# EasyEDA Pro project 4轴机器狗主控板_ProDoc_Board1_2026-10-02.epro, schematic Schematic1

## Sheets
1 引脚分配: Assembly Variant: Basic; Board Name: Board1; Create Date: 2026-08-26; Page Name: P1; Project Name: P006_5轴桌面机器狗; Schematic Name: Schematic1; Update Date: 2026-08-26; Company: 嘉立创EDA; Page Size: A4; Version: V1.0
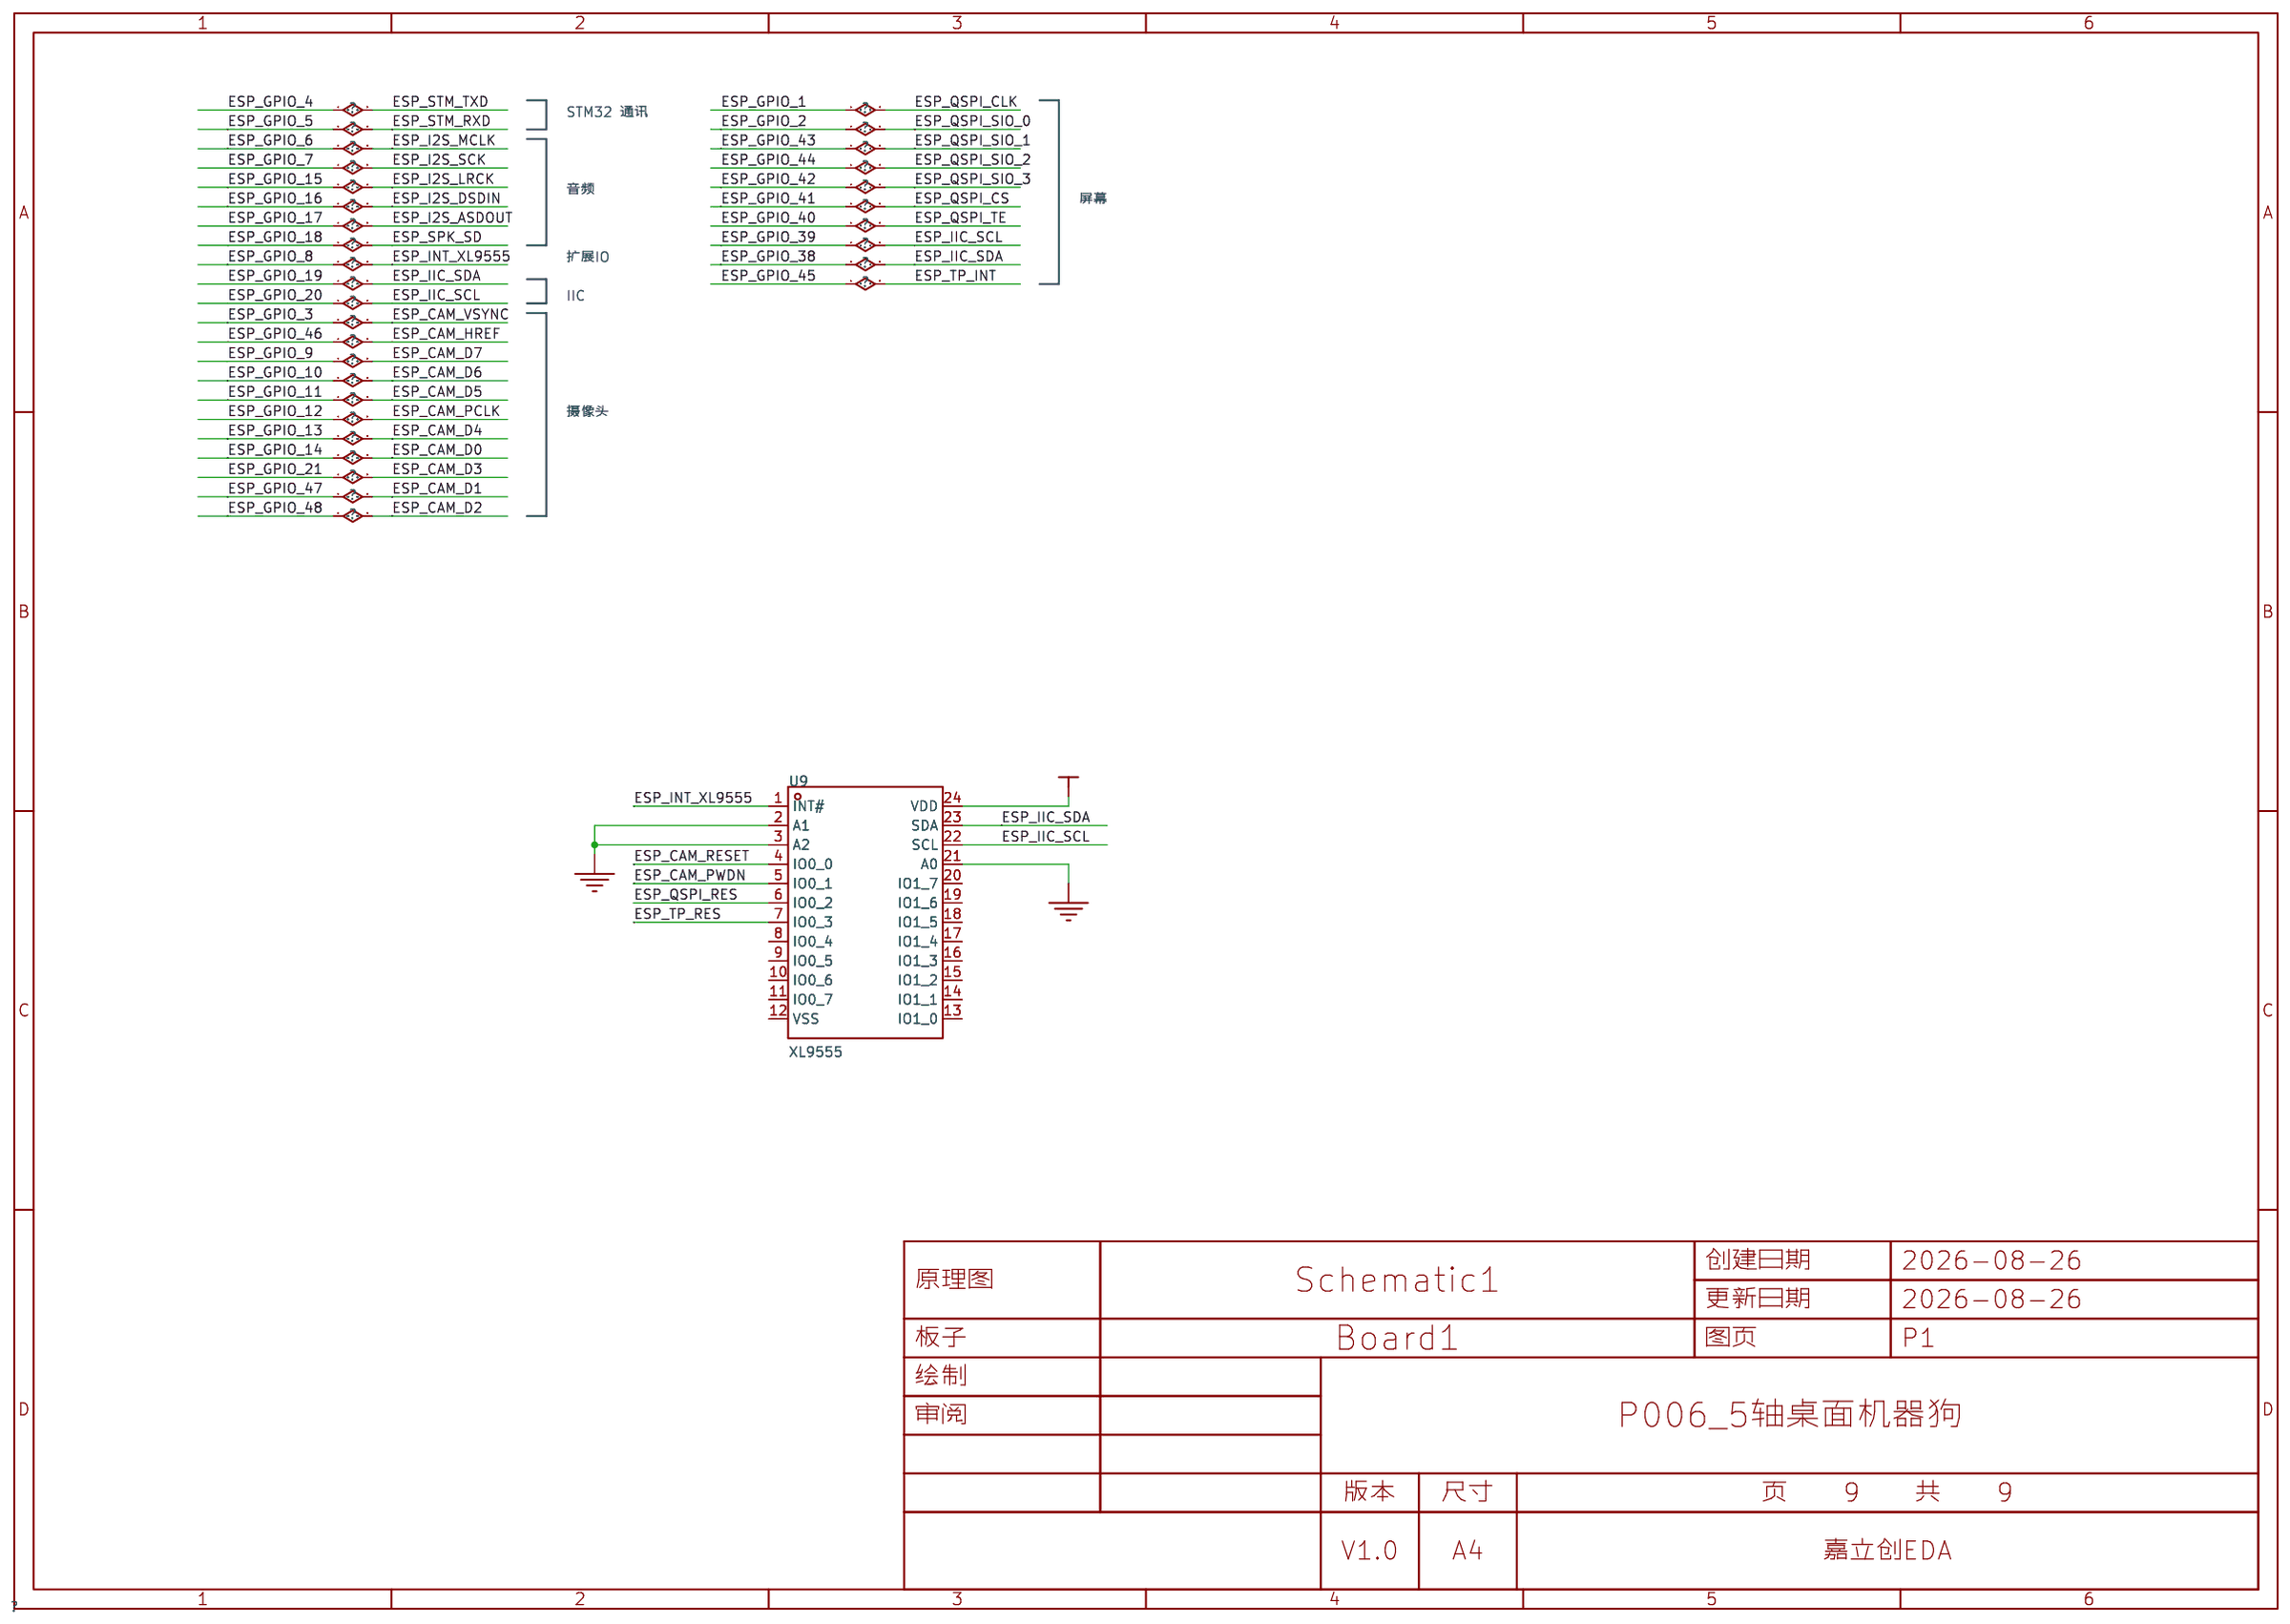
[diagram p0: 引脚分配]
2 电源电路: Create Date: 2026-08-21; Update Date: 2026-08-21
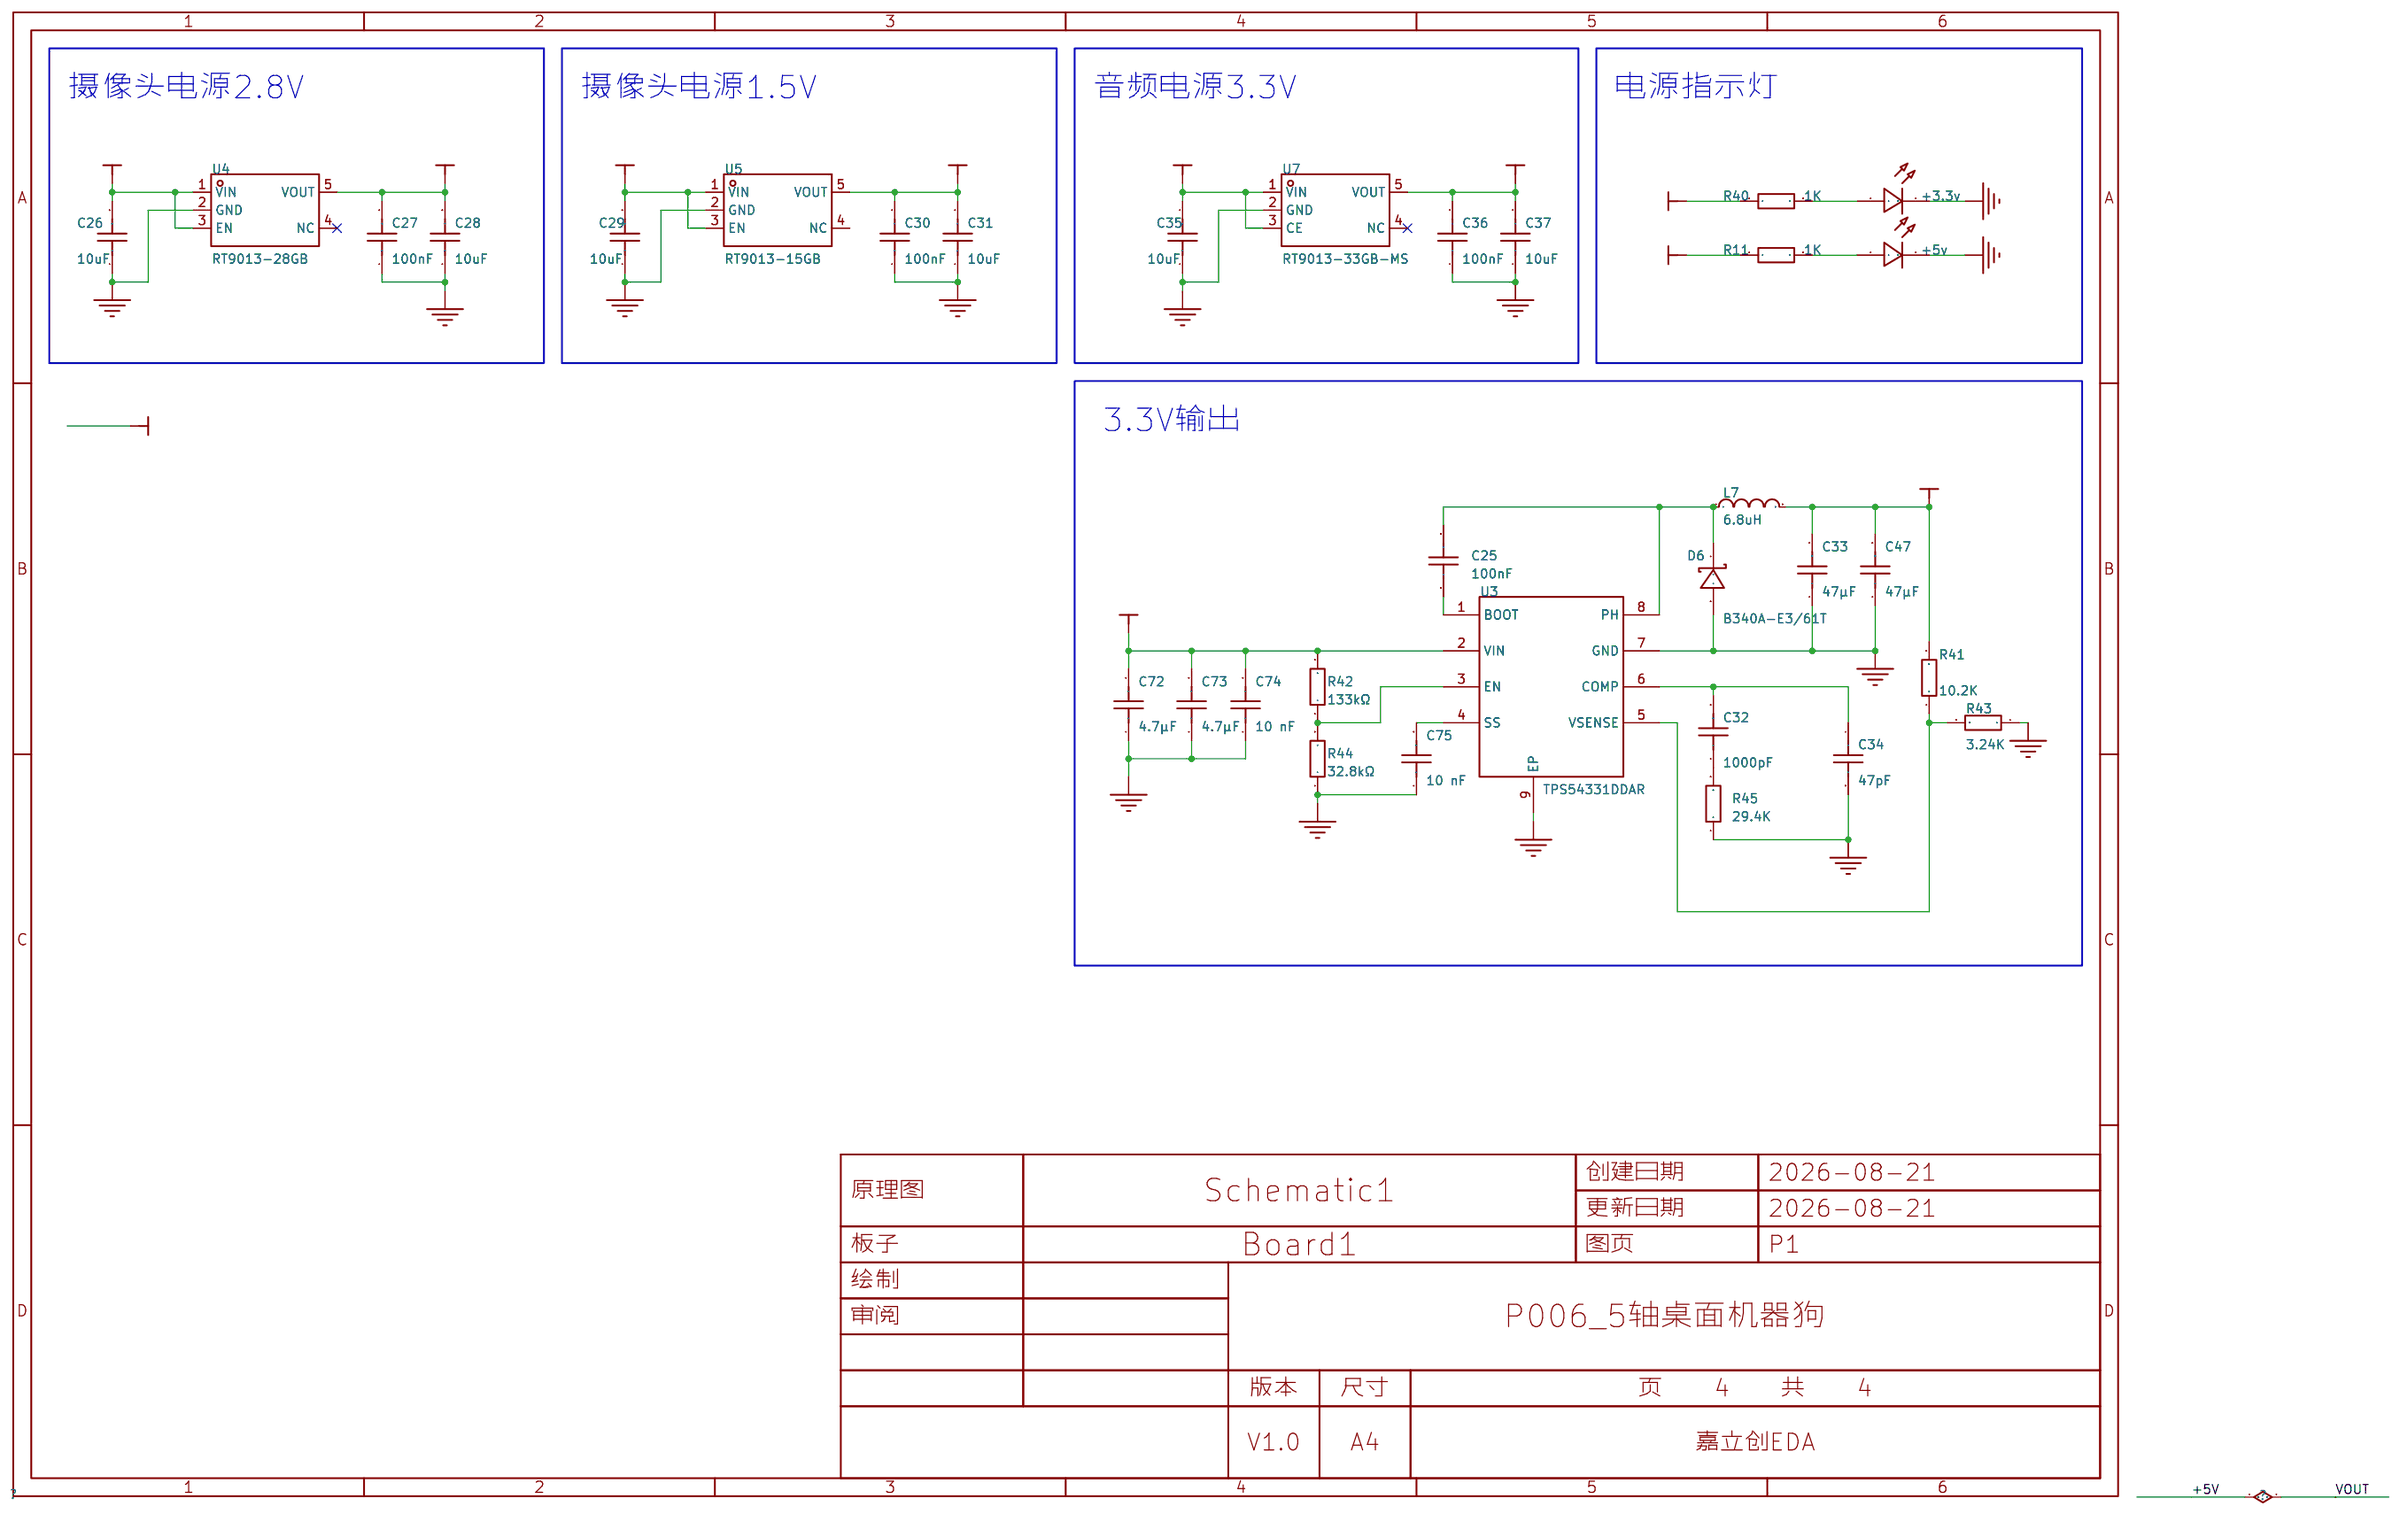
[diagram p1: 电源电路]
3 充电电路: Create Date: 2026-08-21; Update Date: 2026-08-21
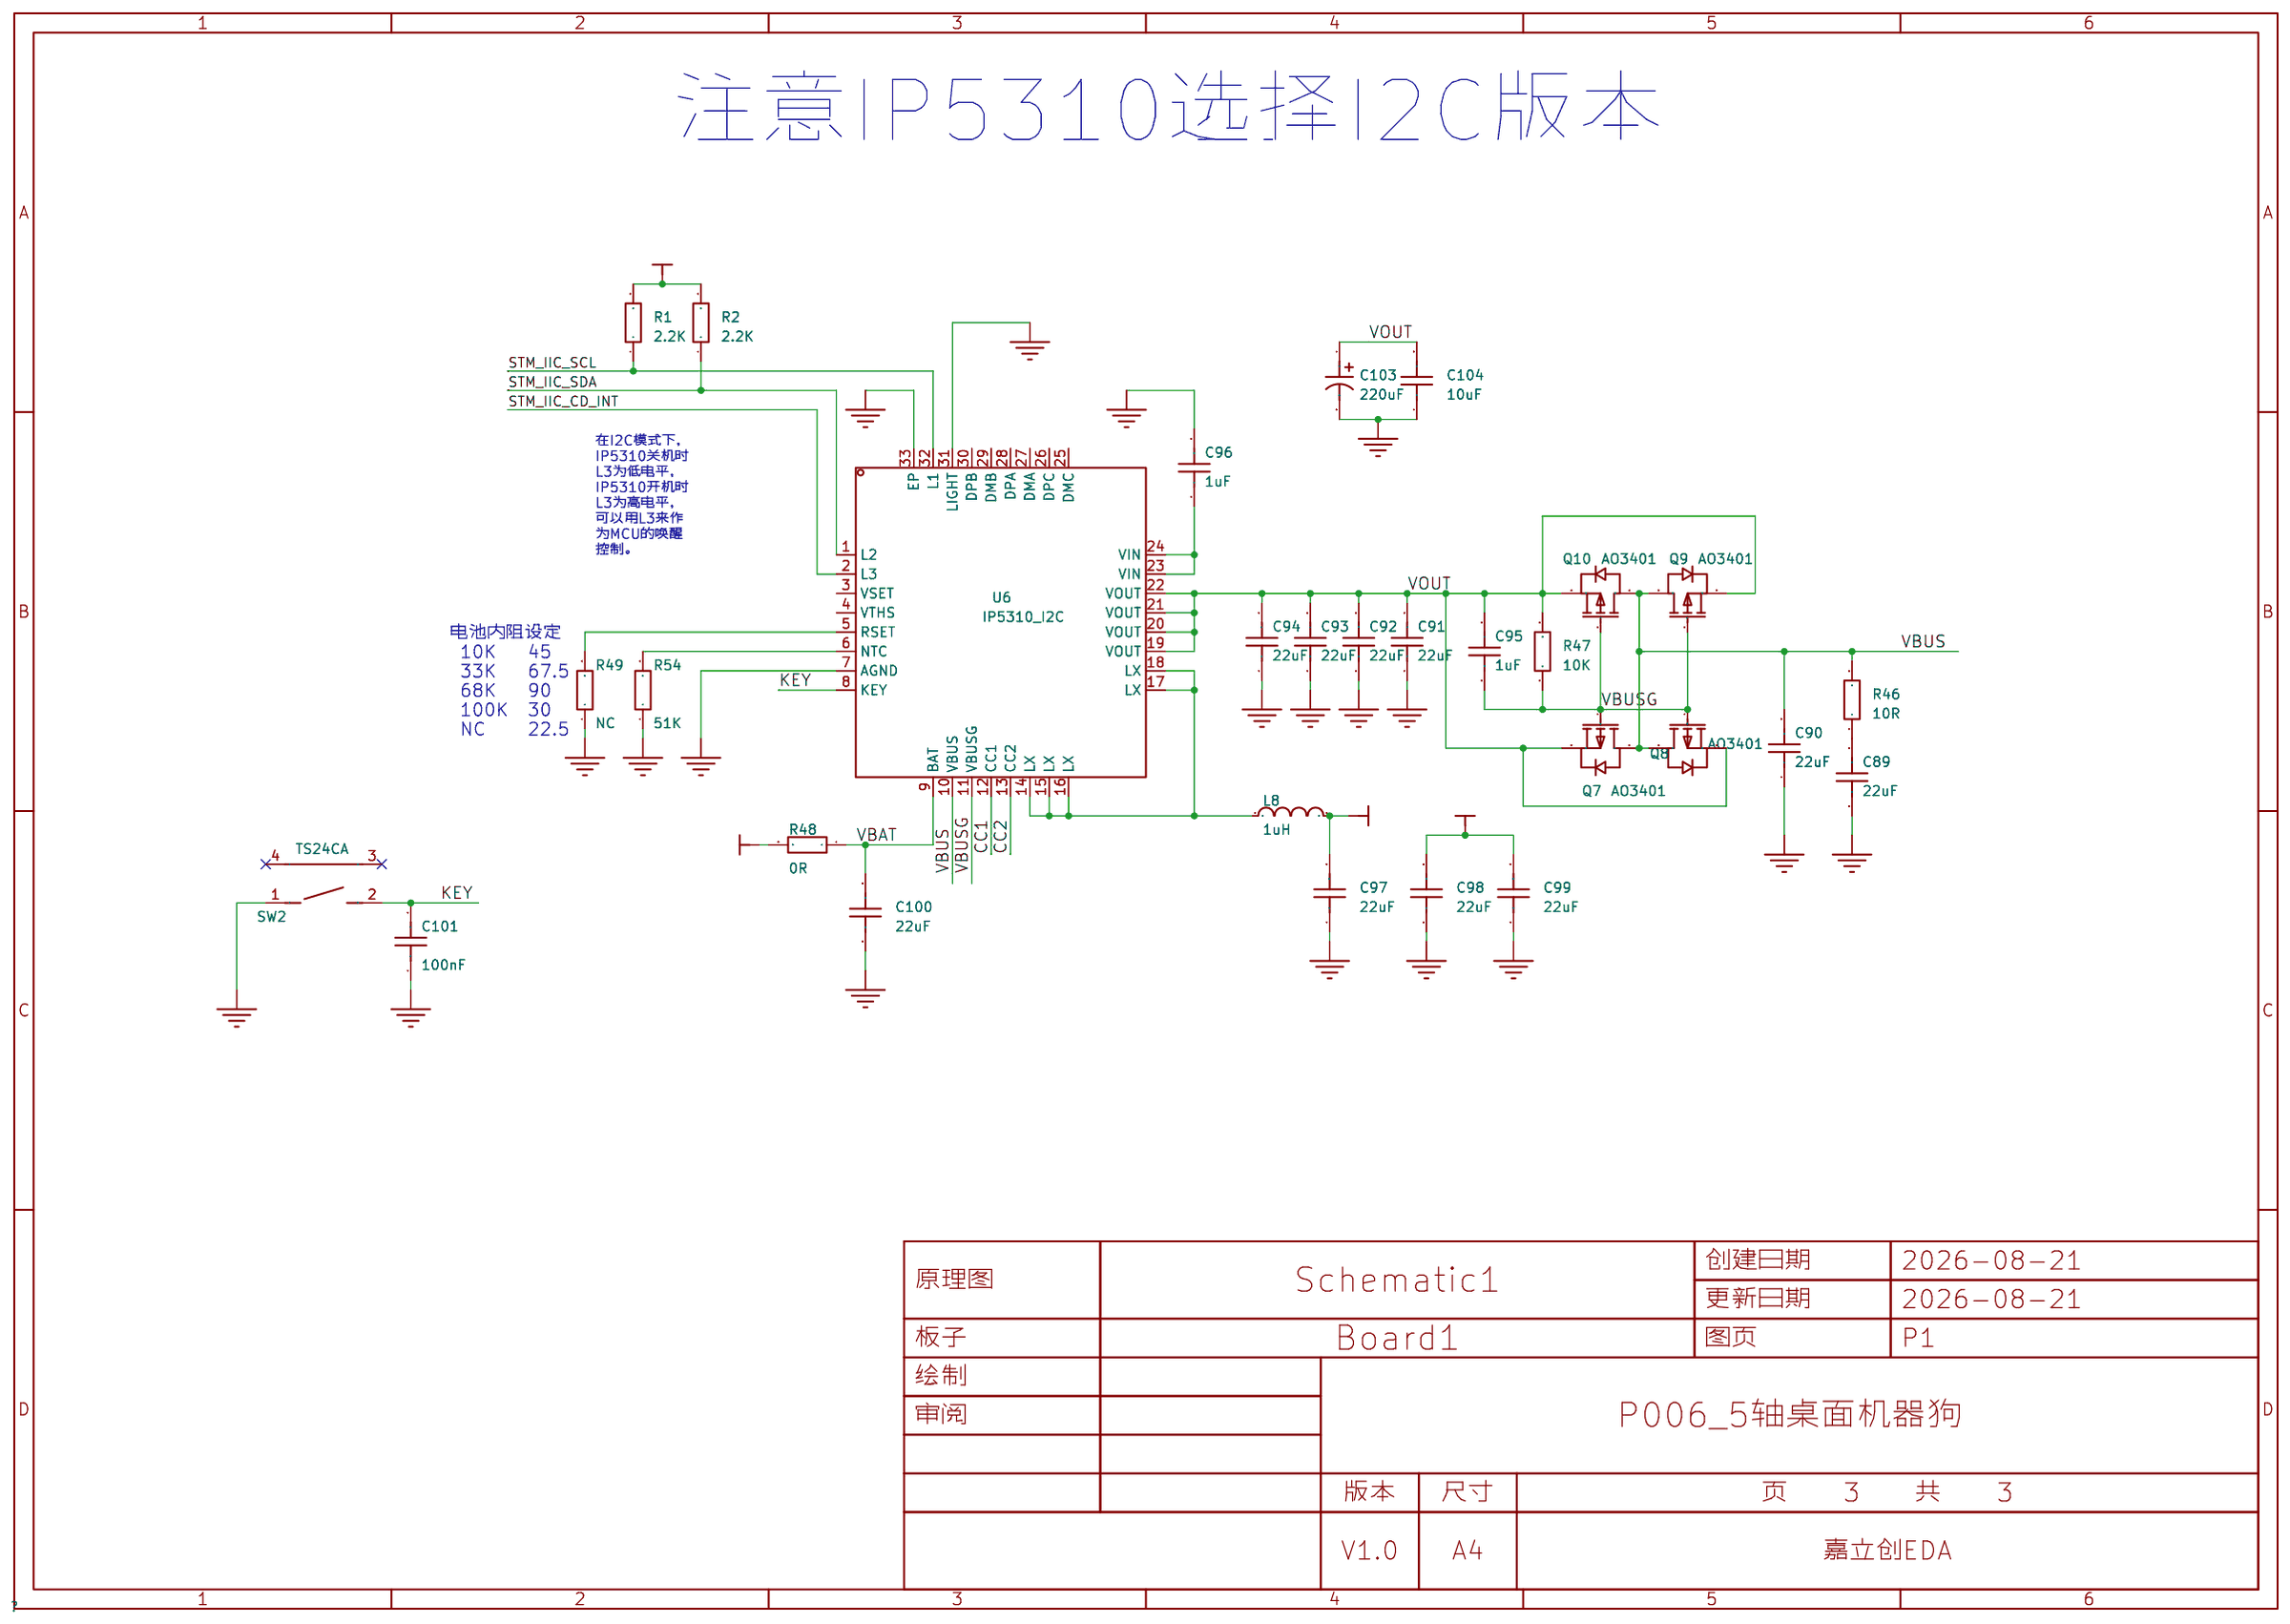
[diagram p2: 充电电路]
4 传感器电路: Create Date: 2026-08-21; Page Name: P3; Update Date: 2026-08-21
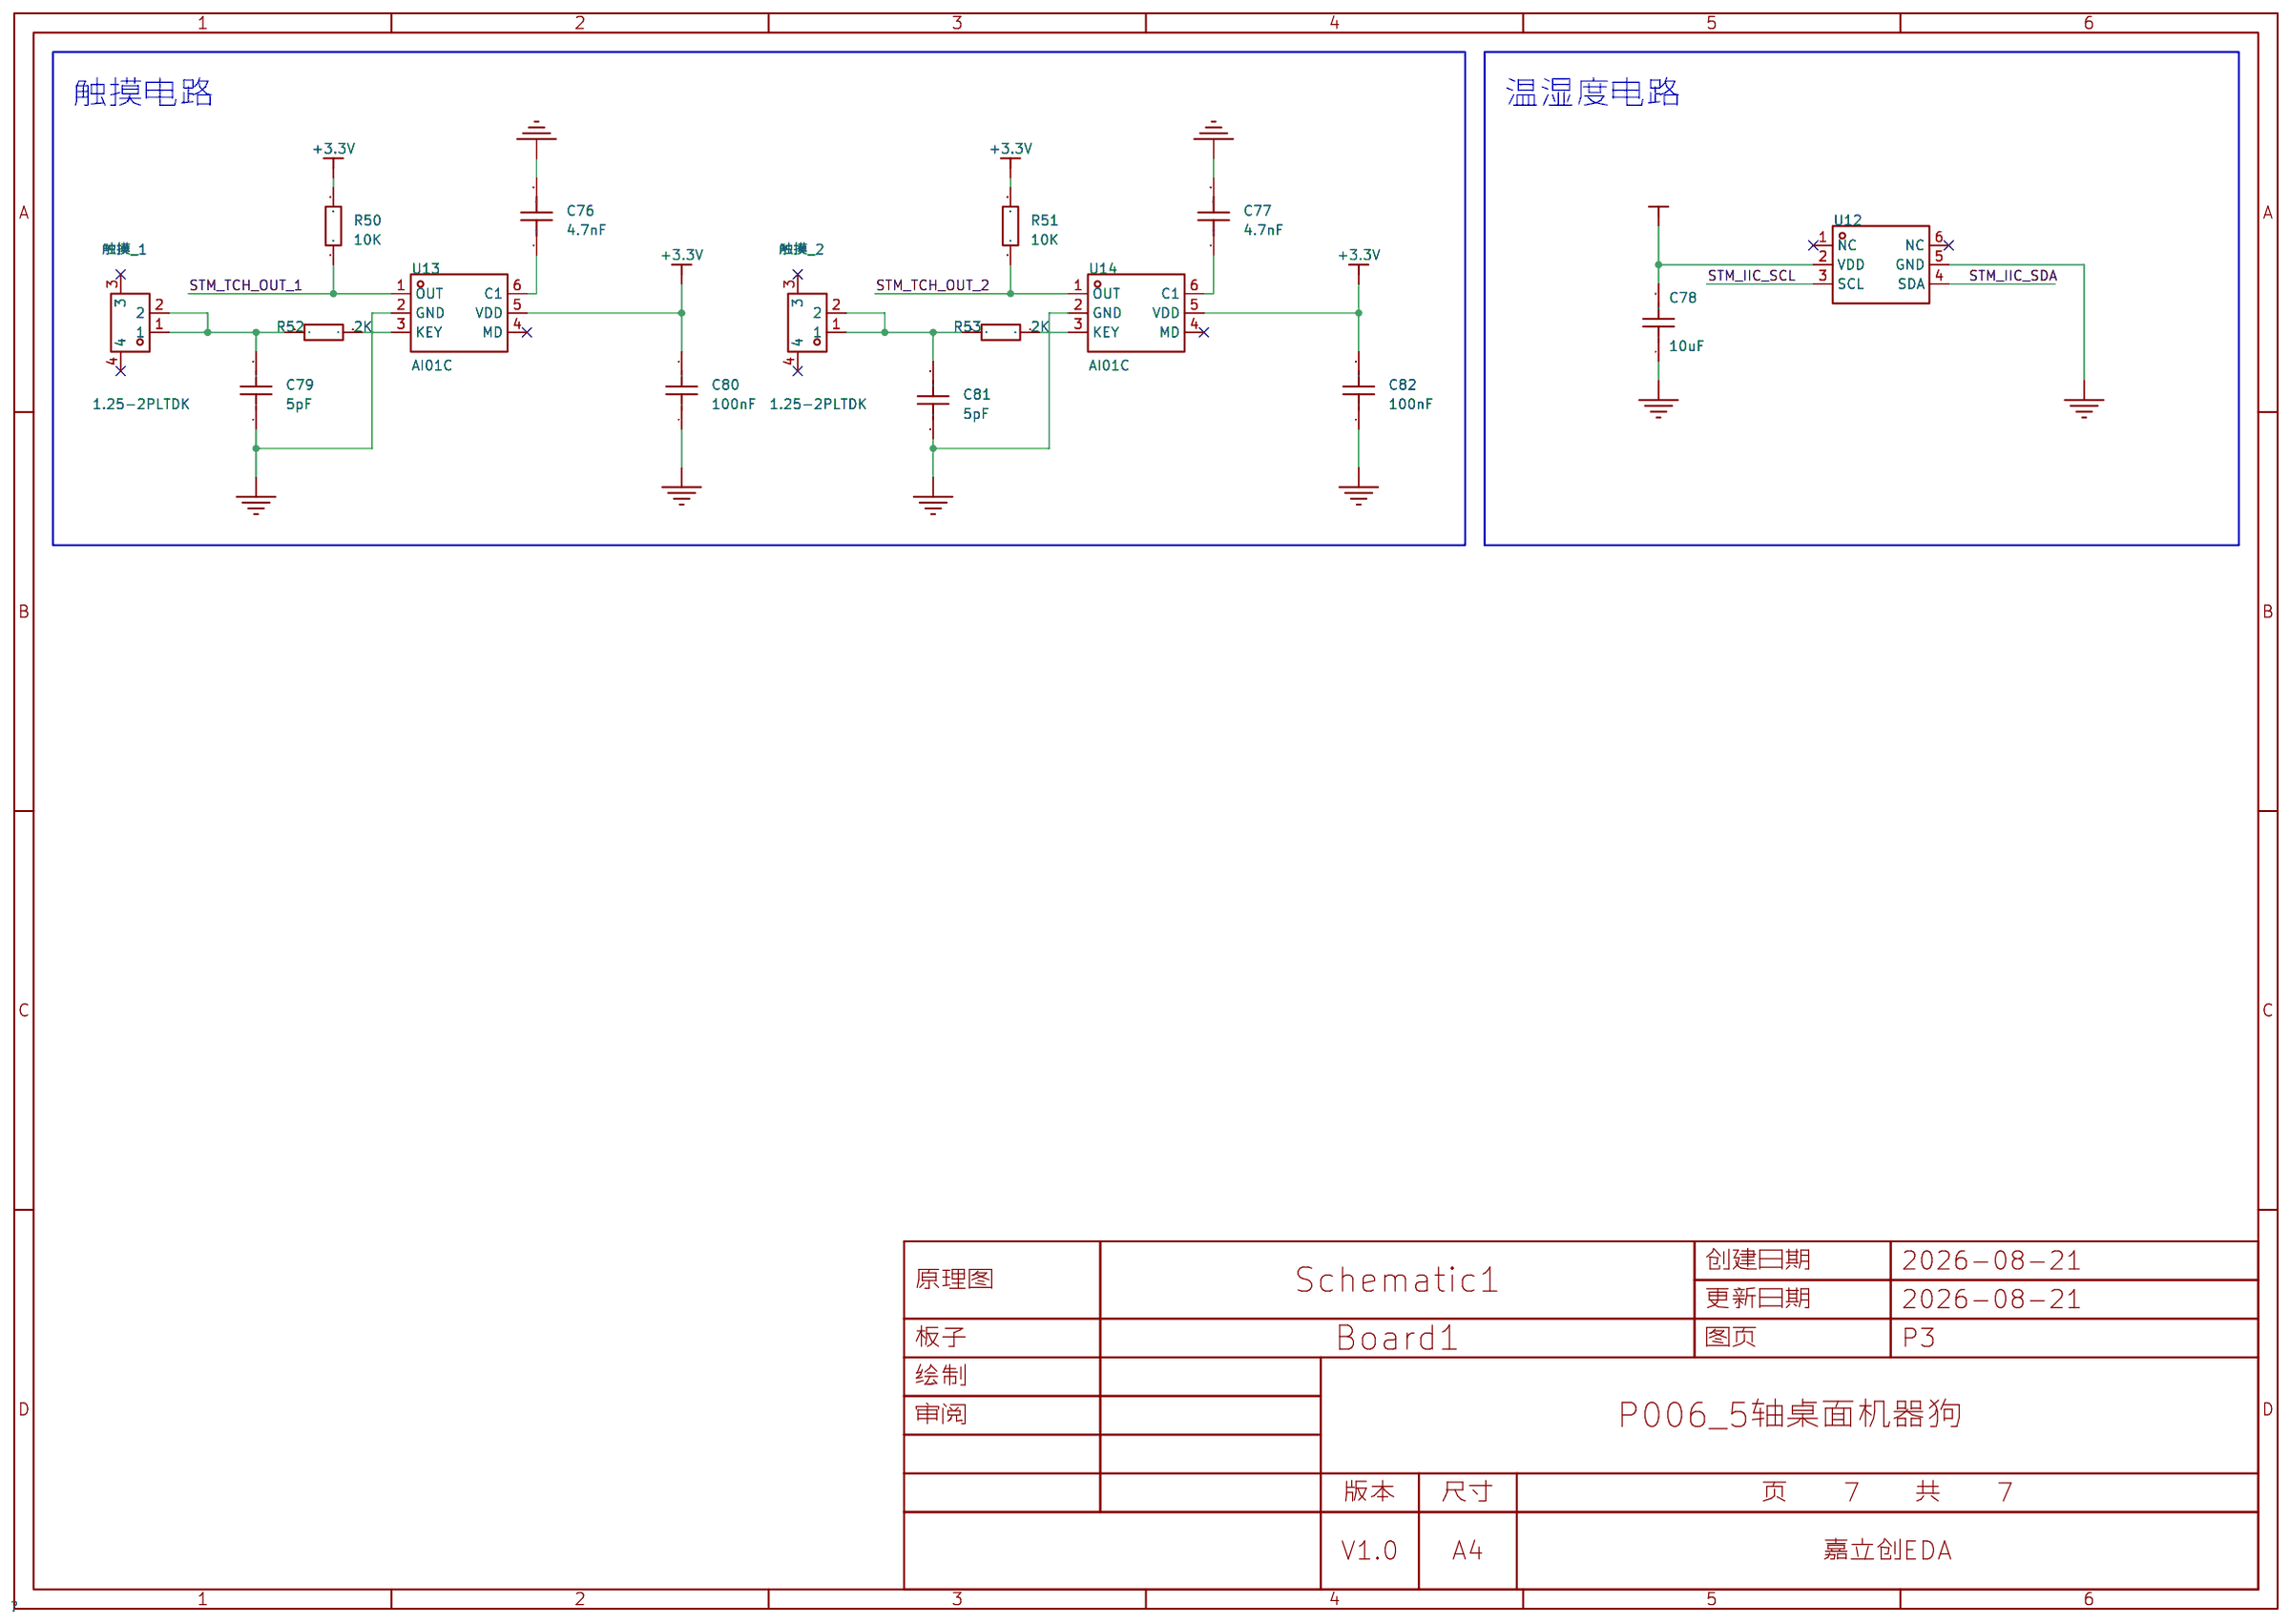
[diagram p3: 传感器电路]
5 视频电路: Create Date: 2026-08-21; Update Date: 2026-08-21
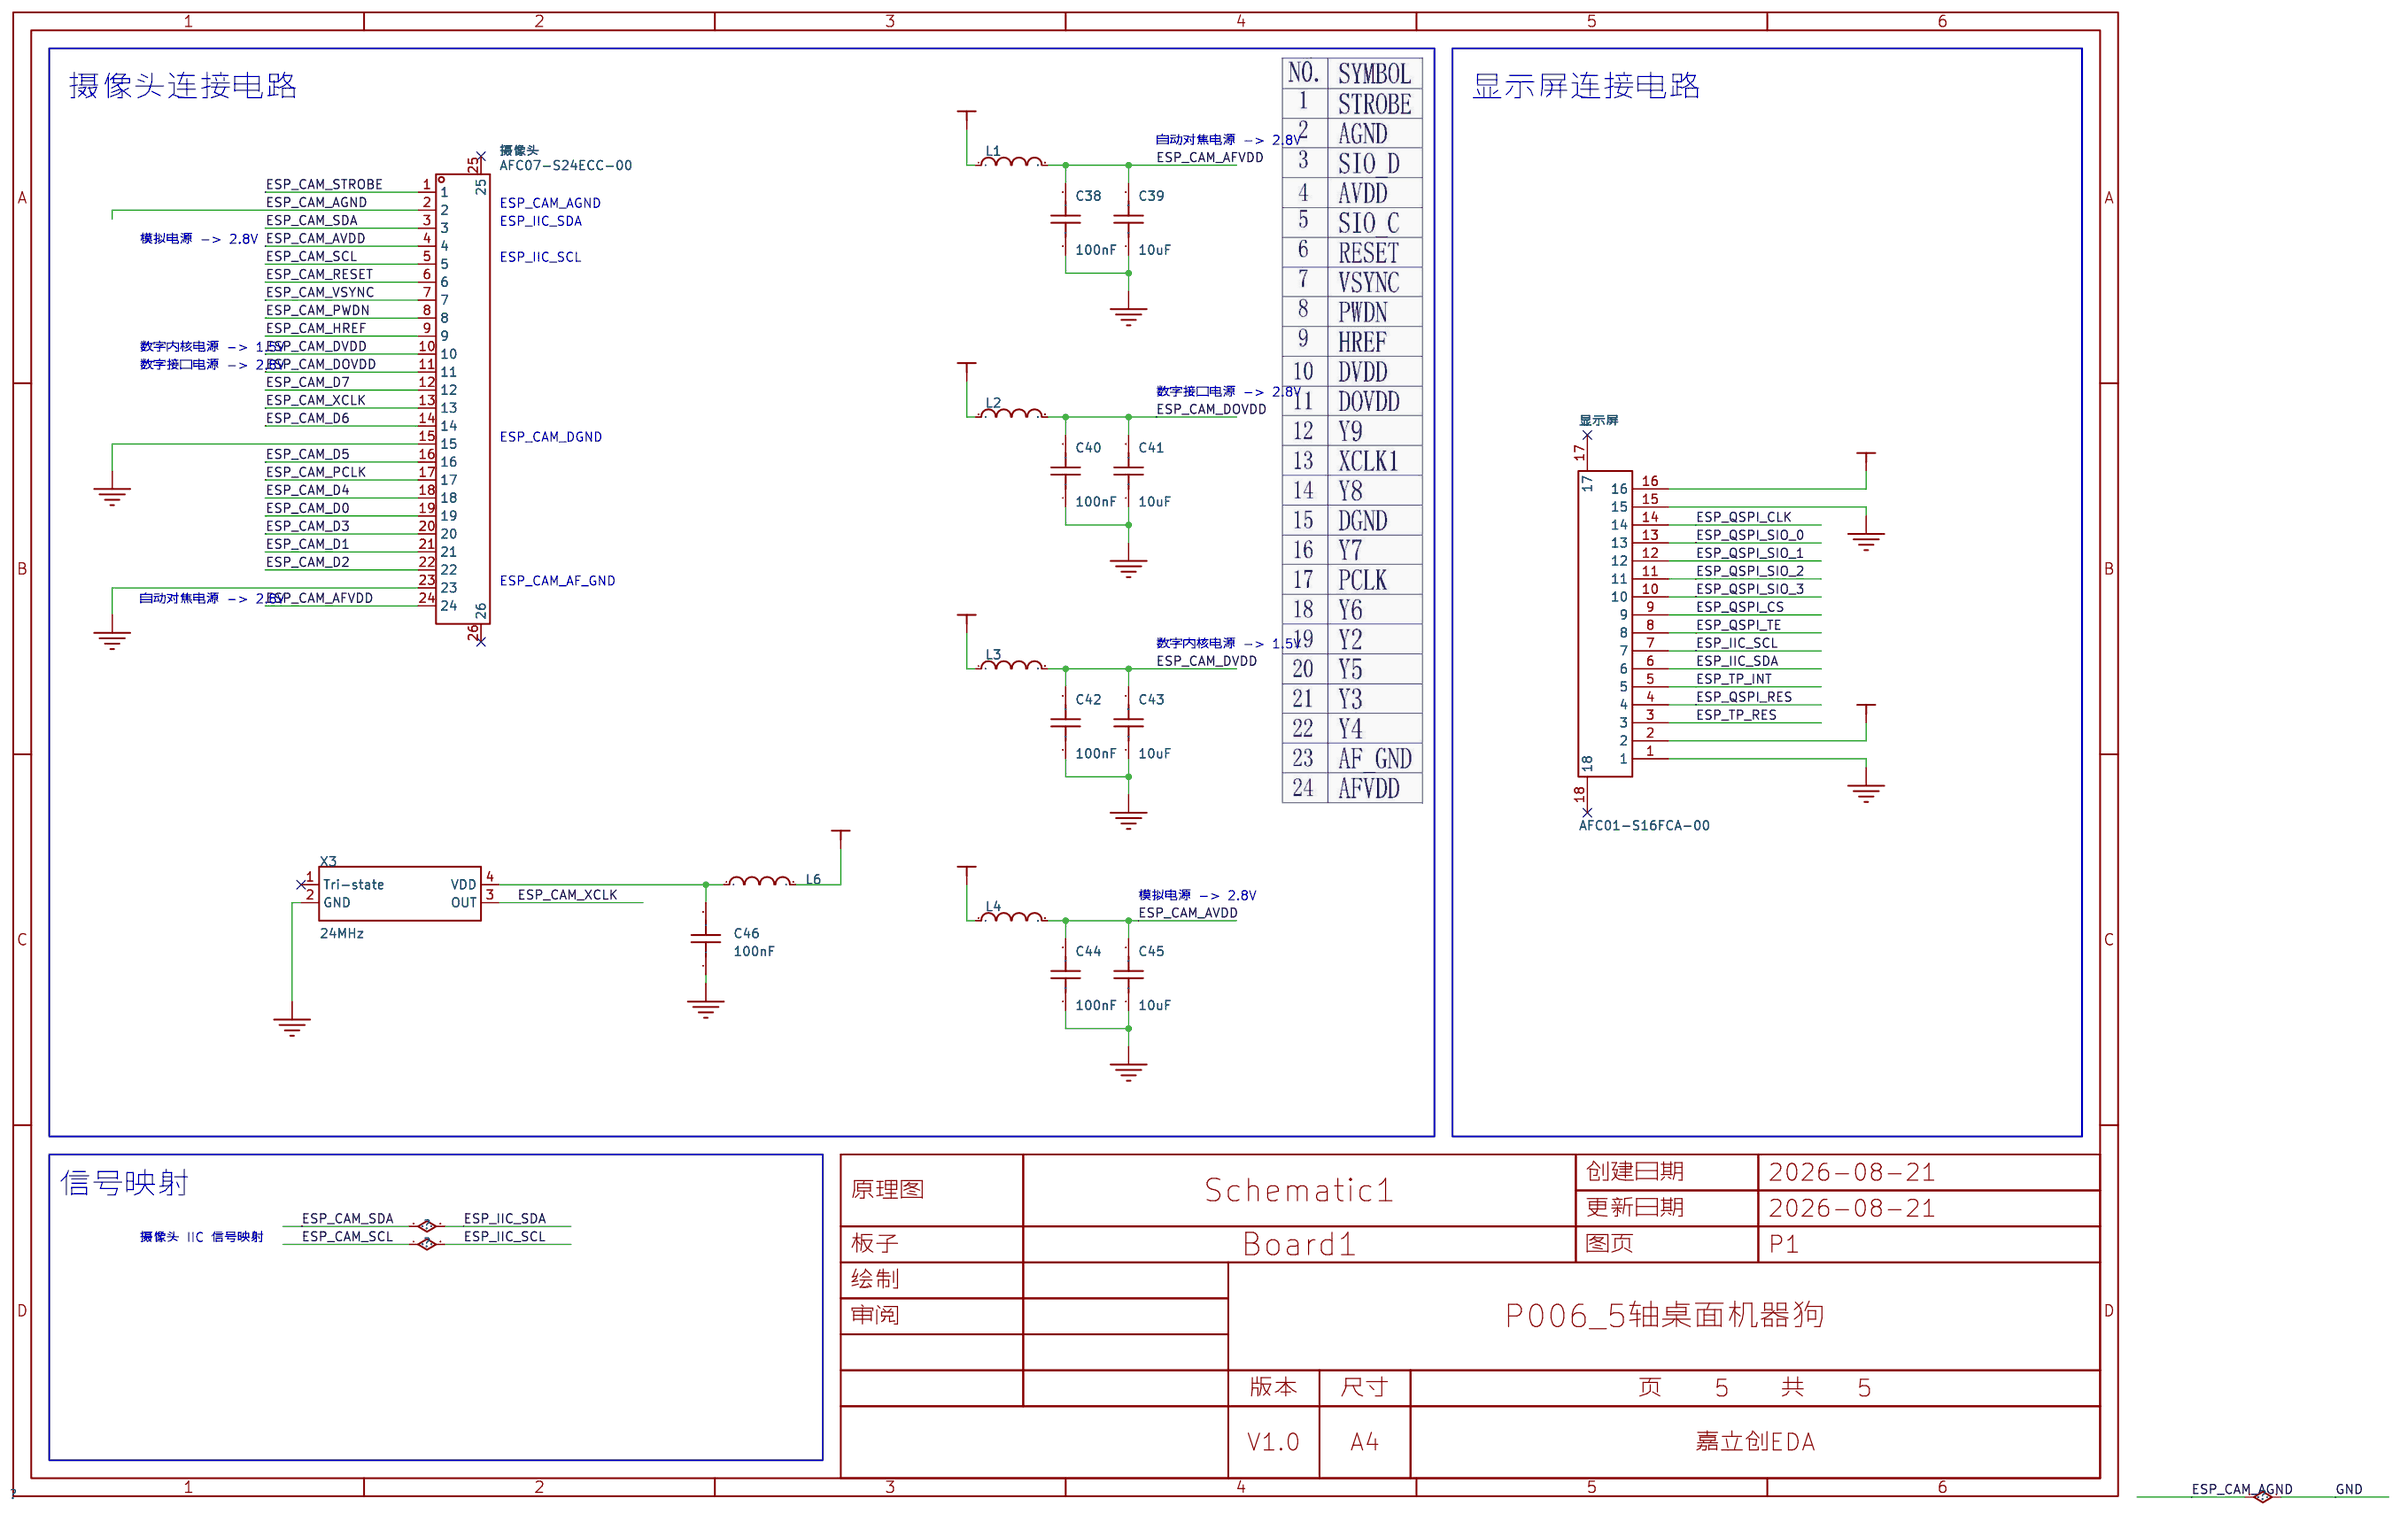
[diagram p4: 视频电路]
6 执行器电路: Create Date: 2026-08-21; Page Name: P4; Update Date: 2026-08-21
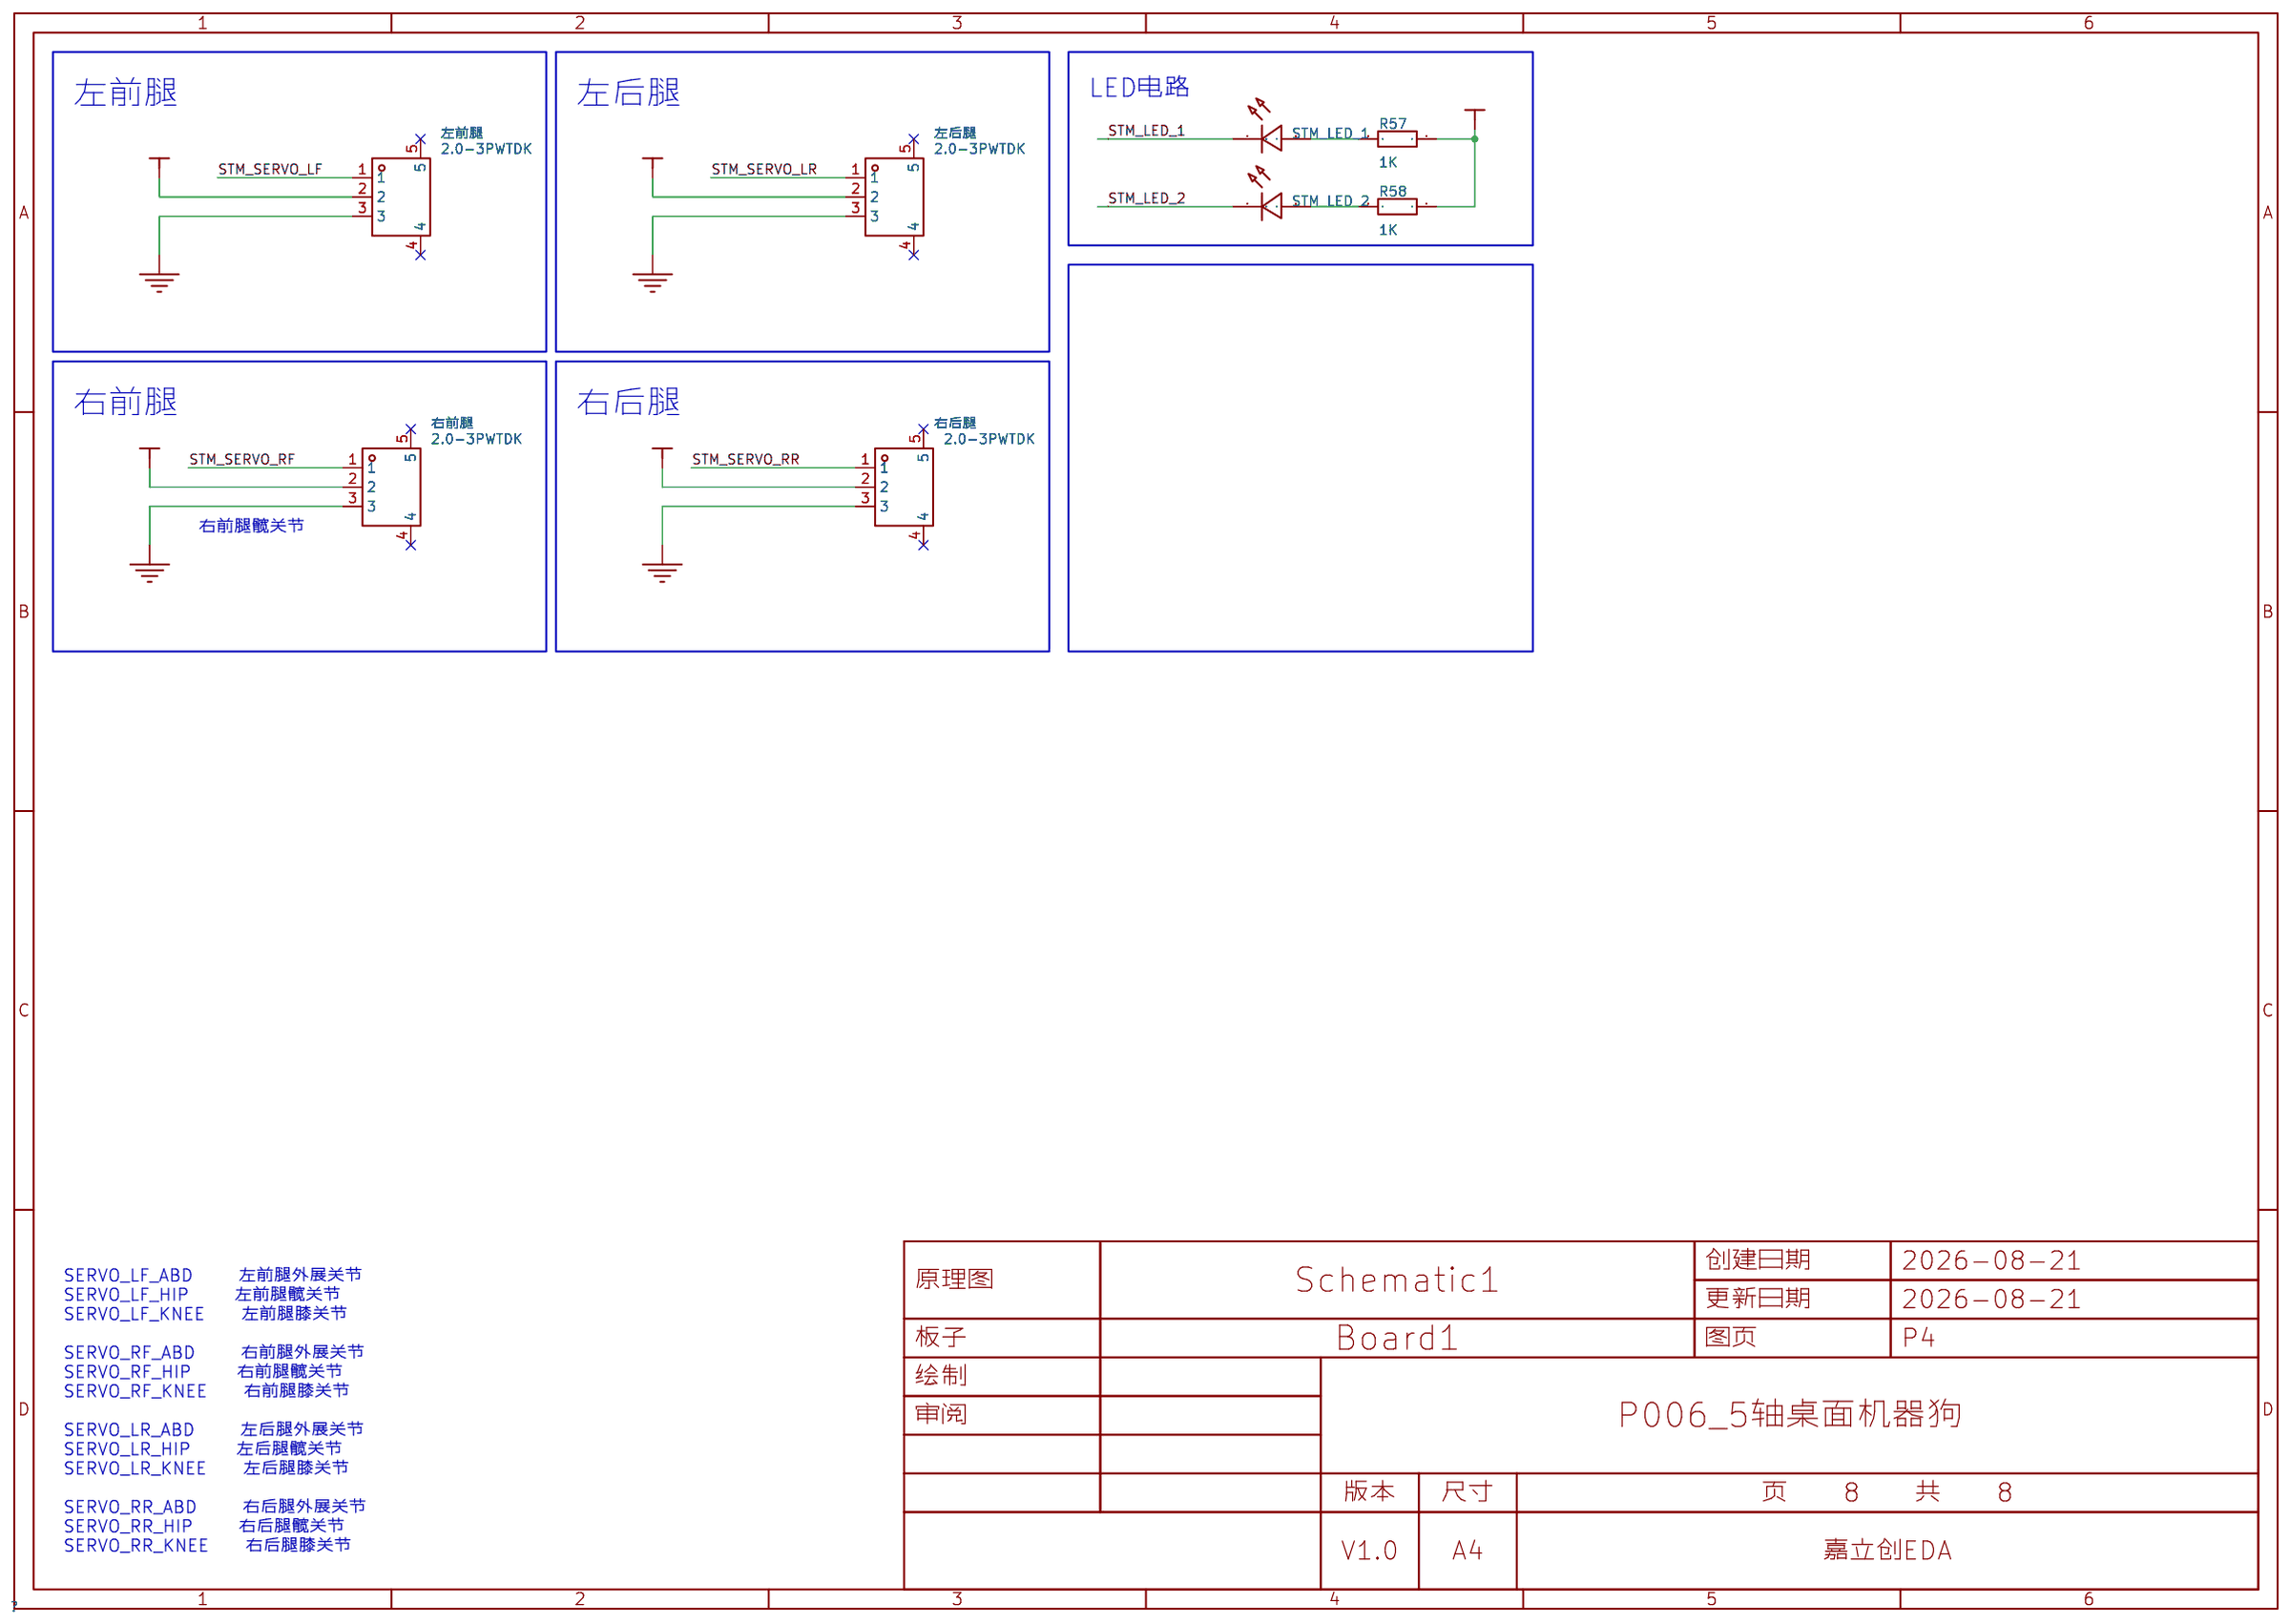
[diagram p5: 执行器电路]
7 ESP32主控电路: Create Date: 2026-08-21; Update Date: 2026-08-21
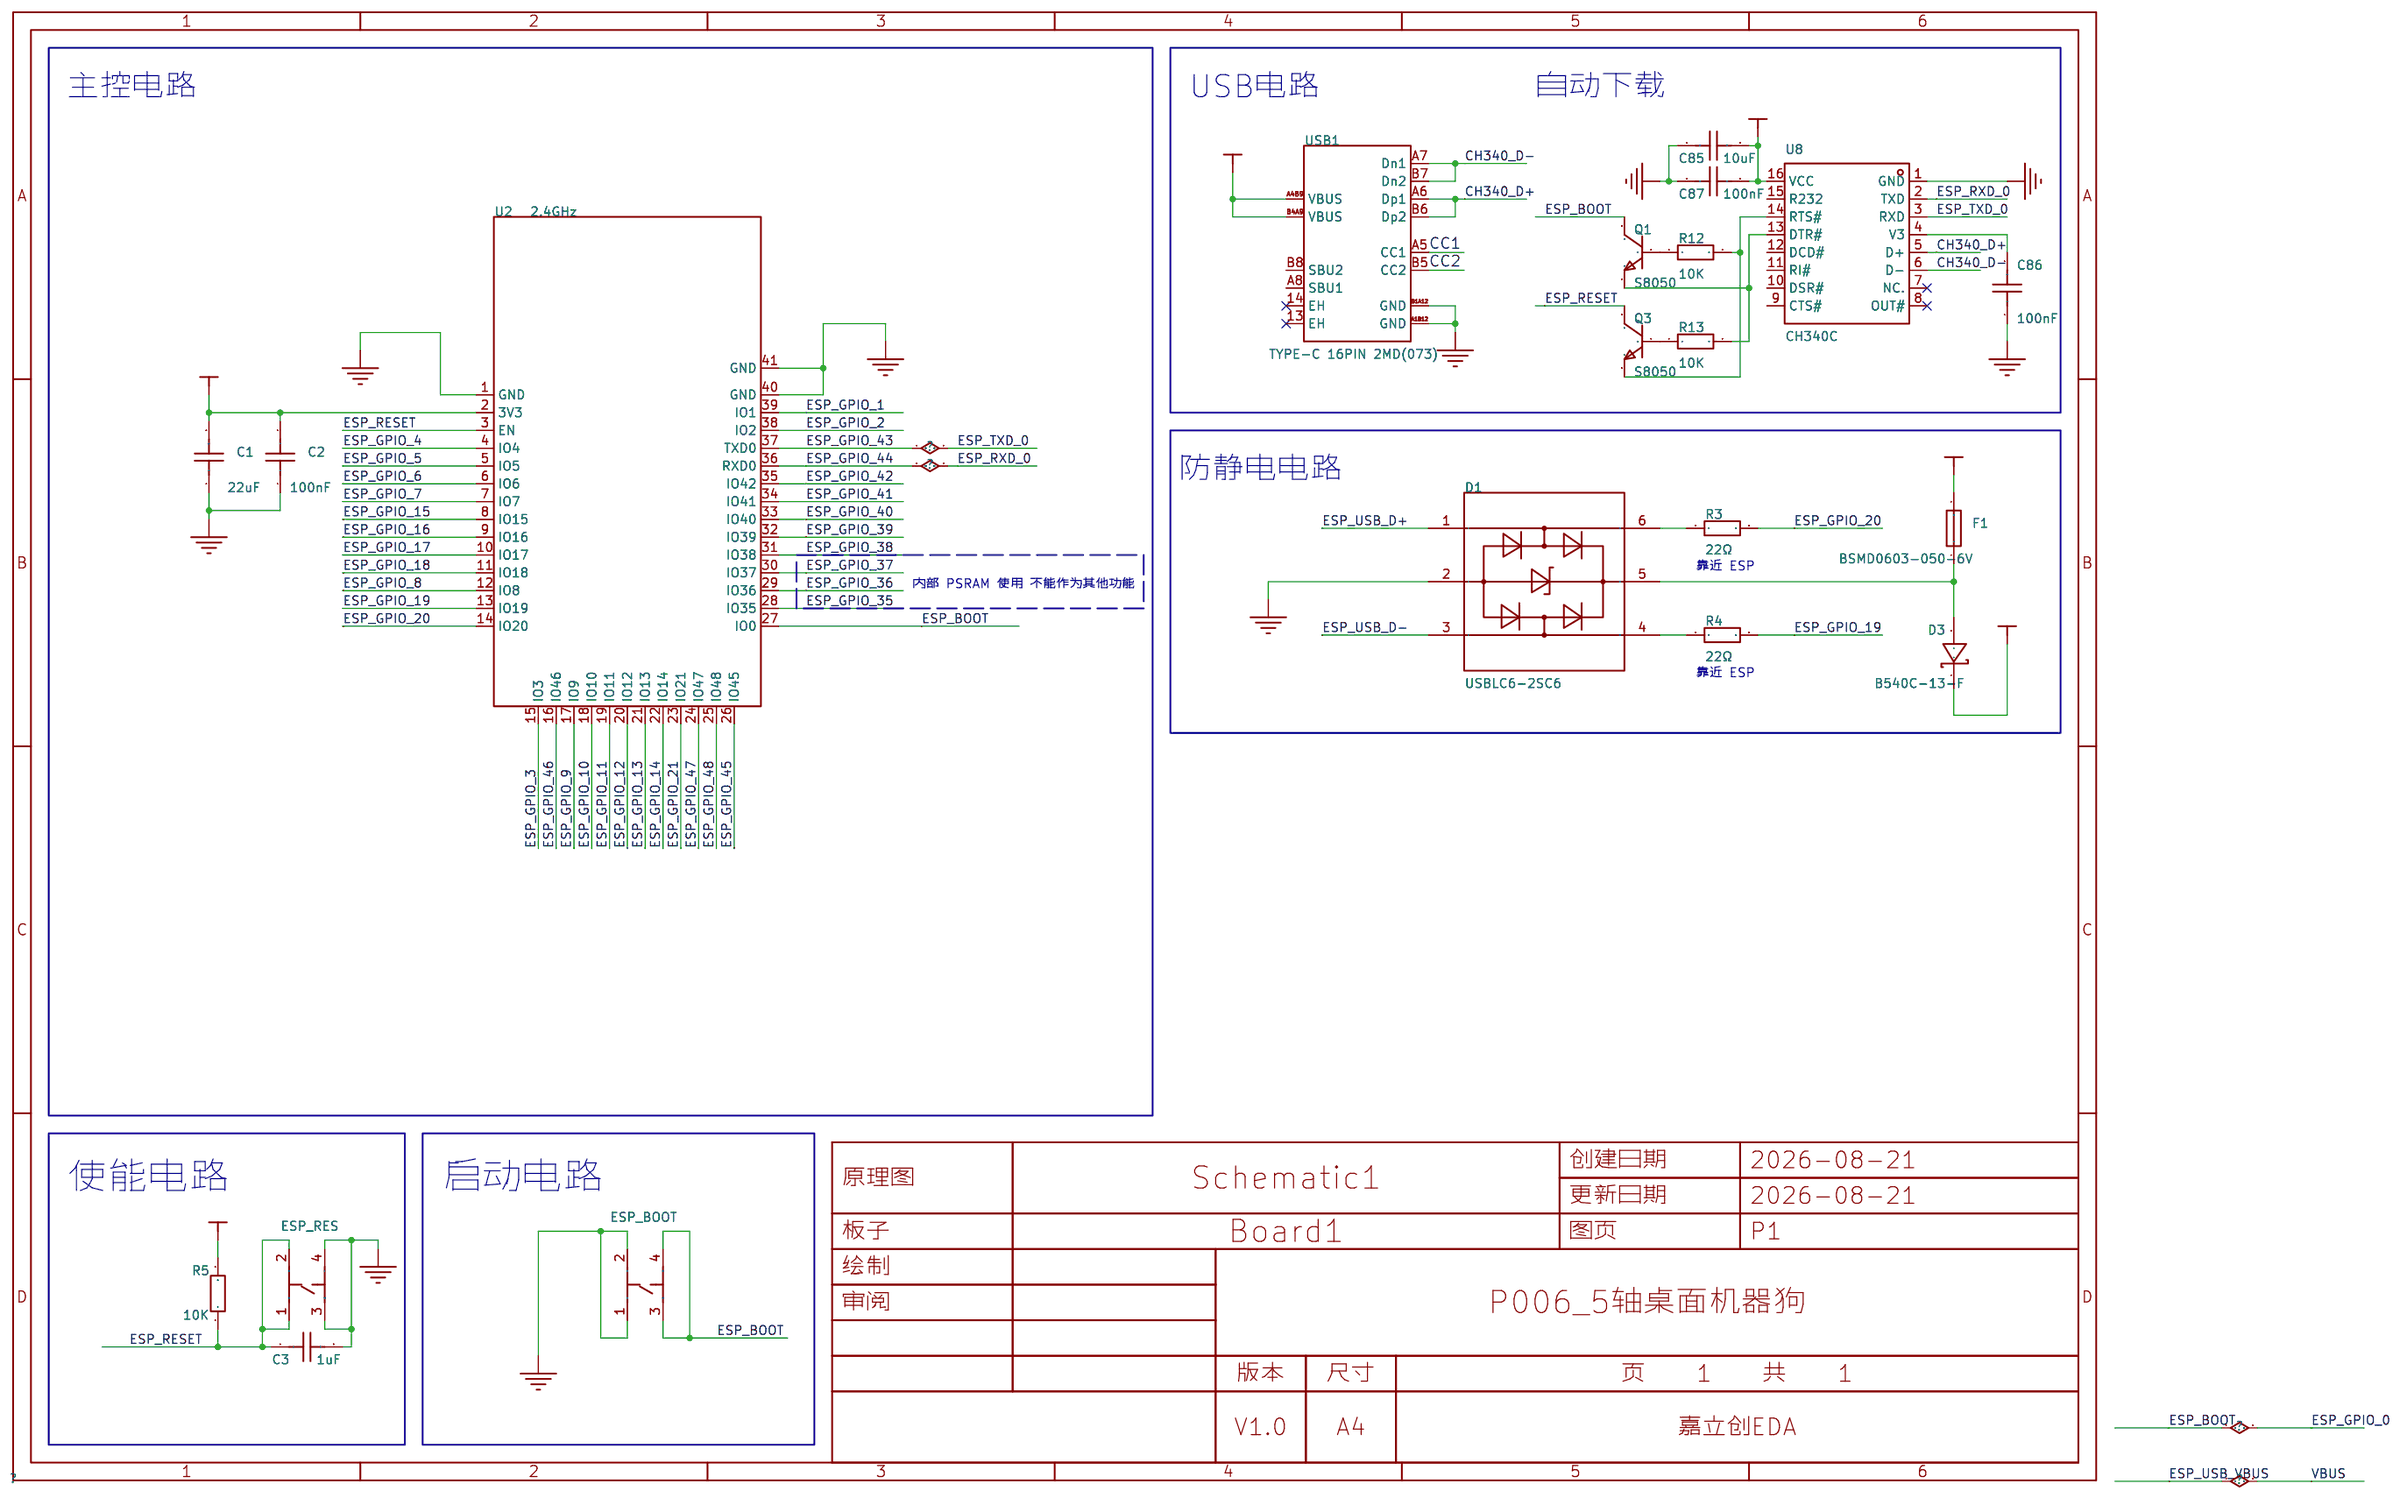
[diagram p6: ESP32主控电路]
8 STM32主控电路: Create Date: 2026-08-21; Update Date: 2026-08-21
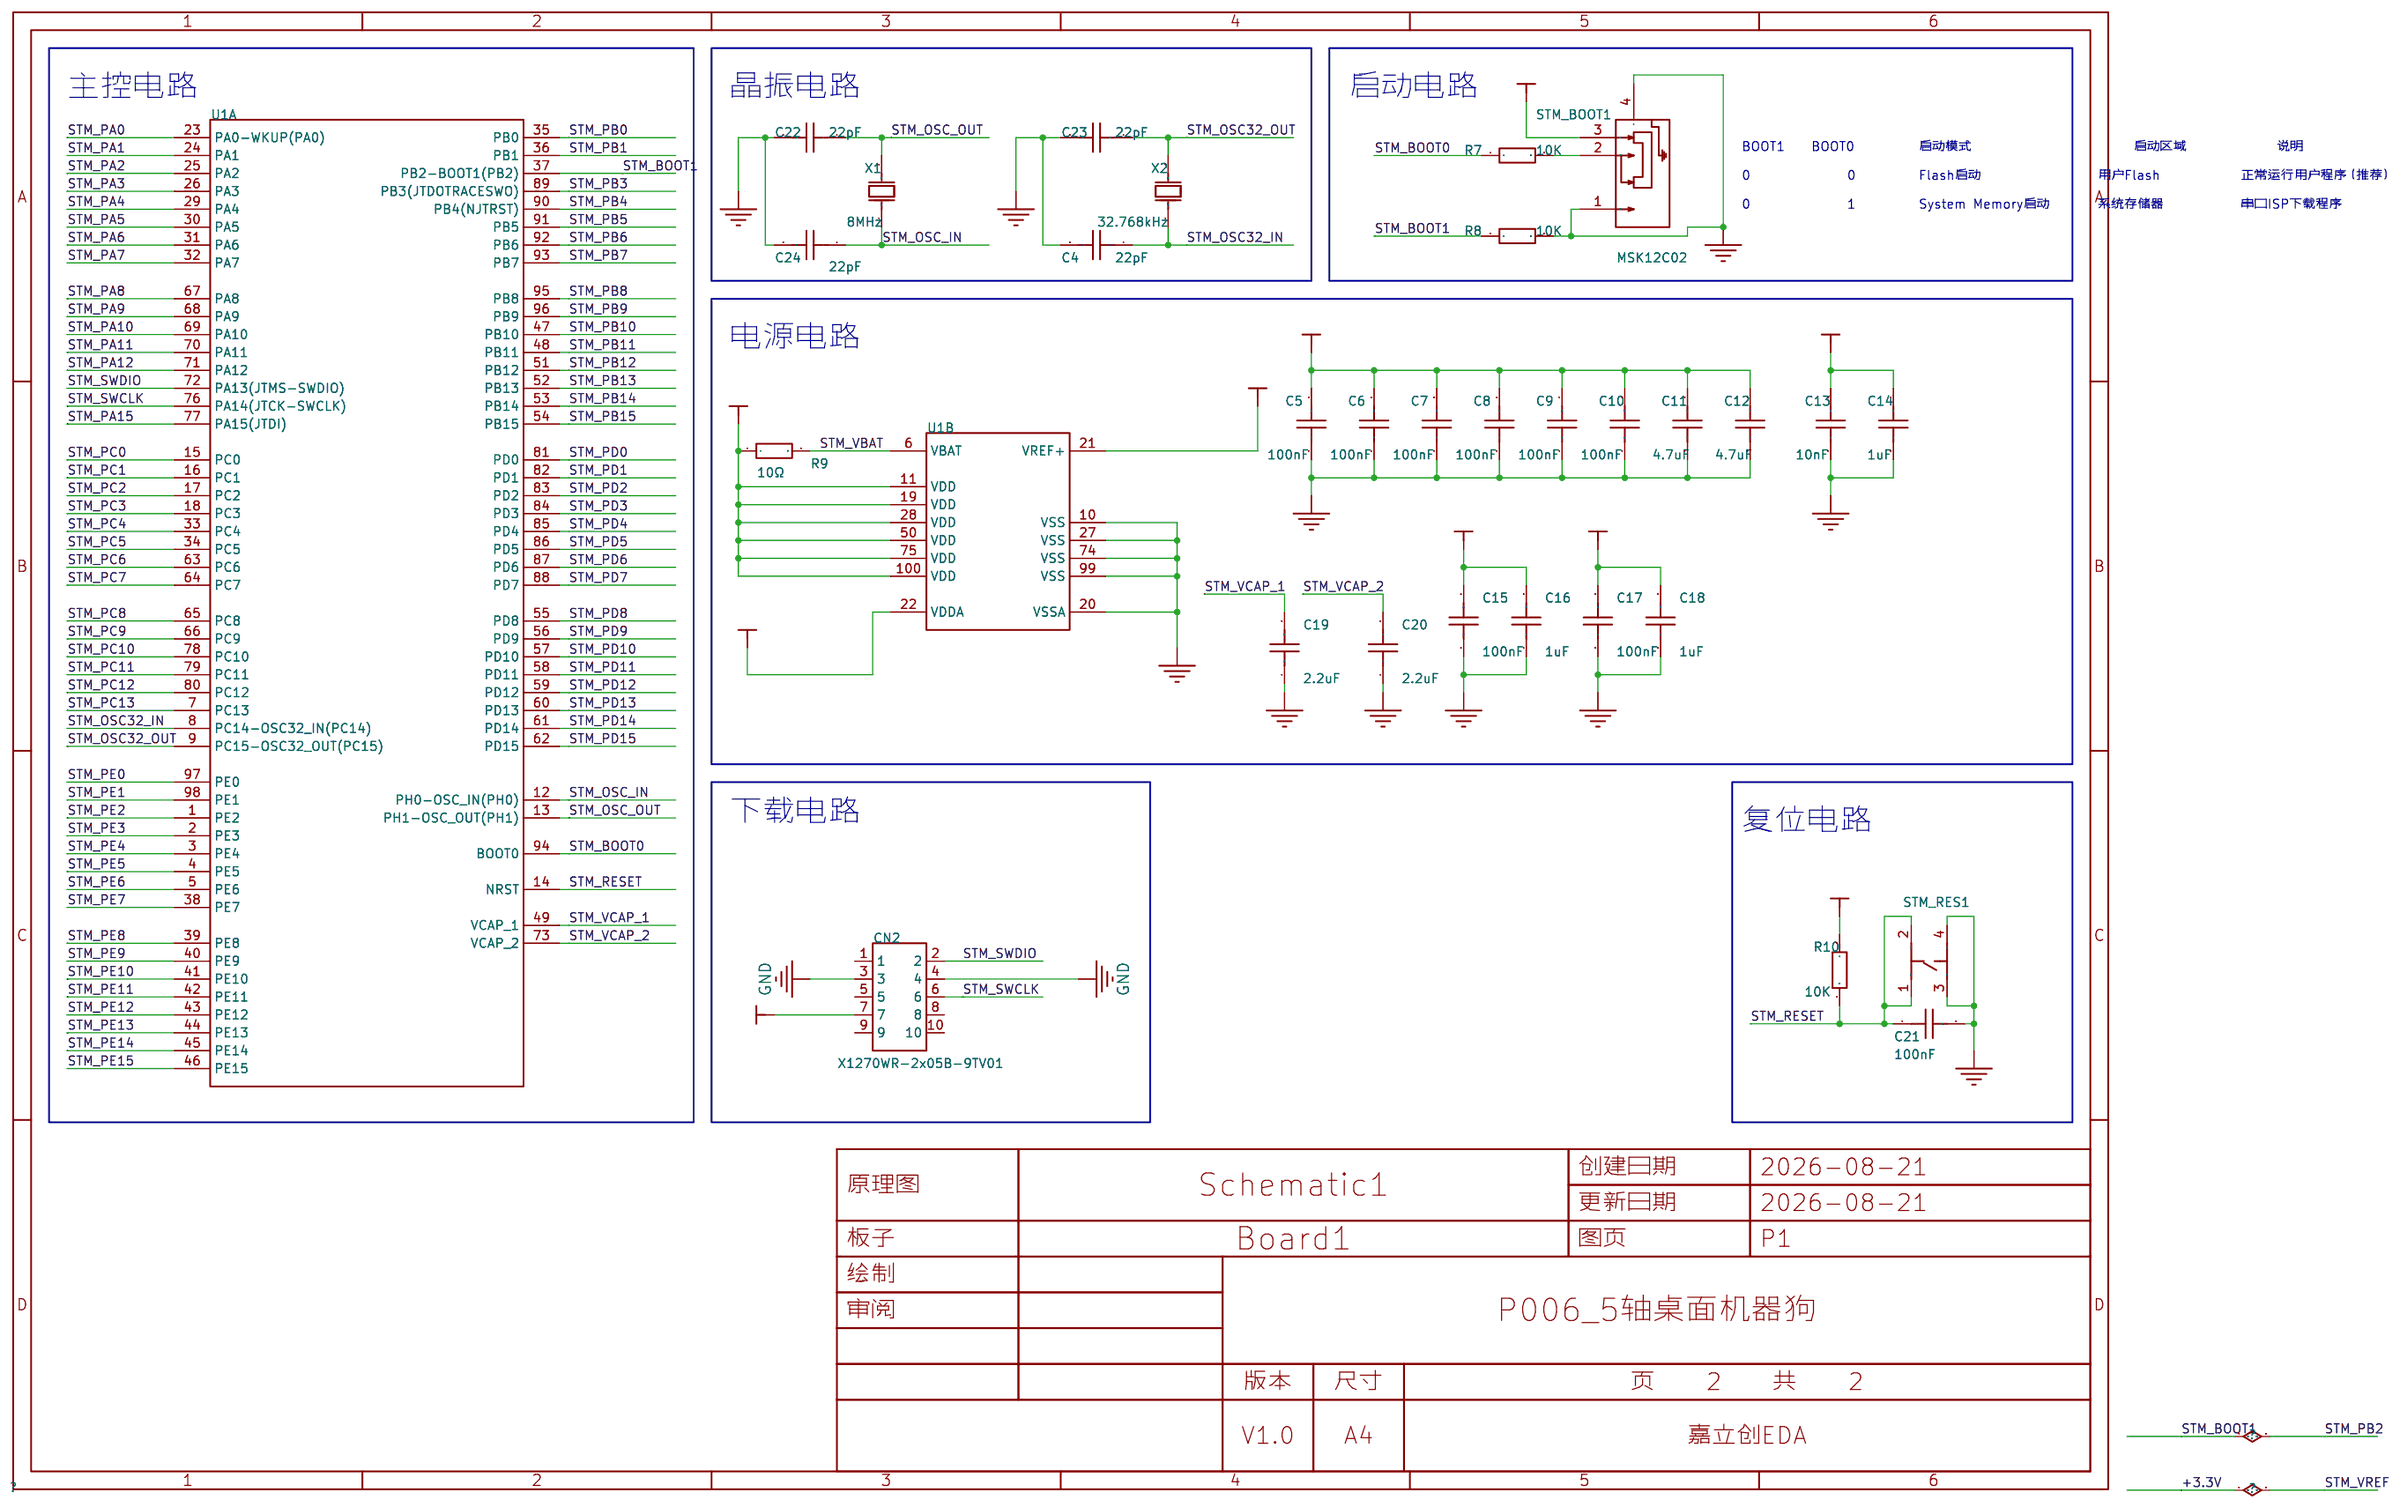
[diagram p7: STM32主控电路]
9 音频电路: Create Date: 2026-08-21; Page Name: P2; Update Date: 2026-08-21
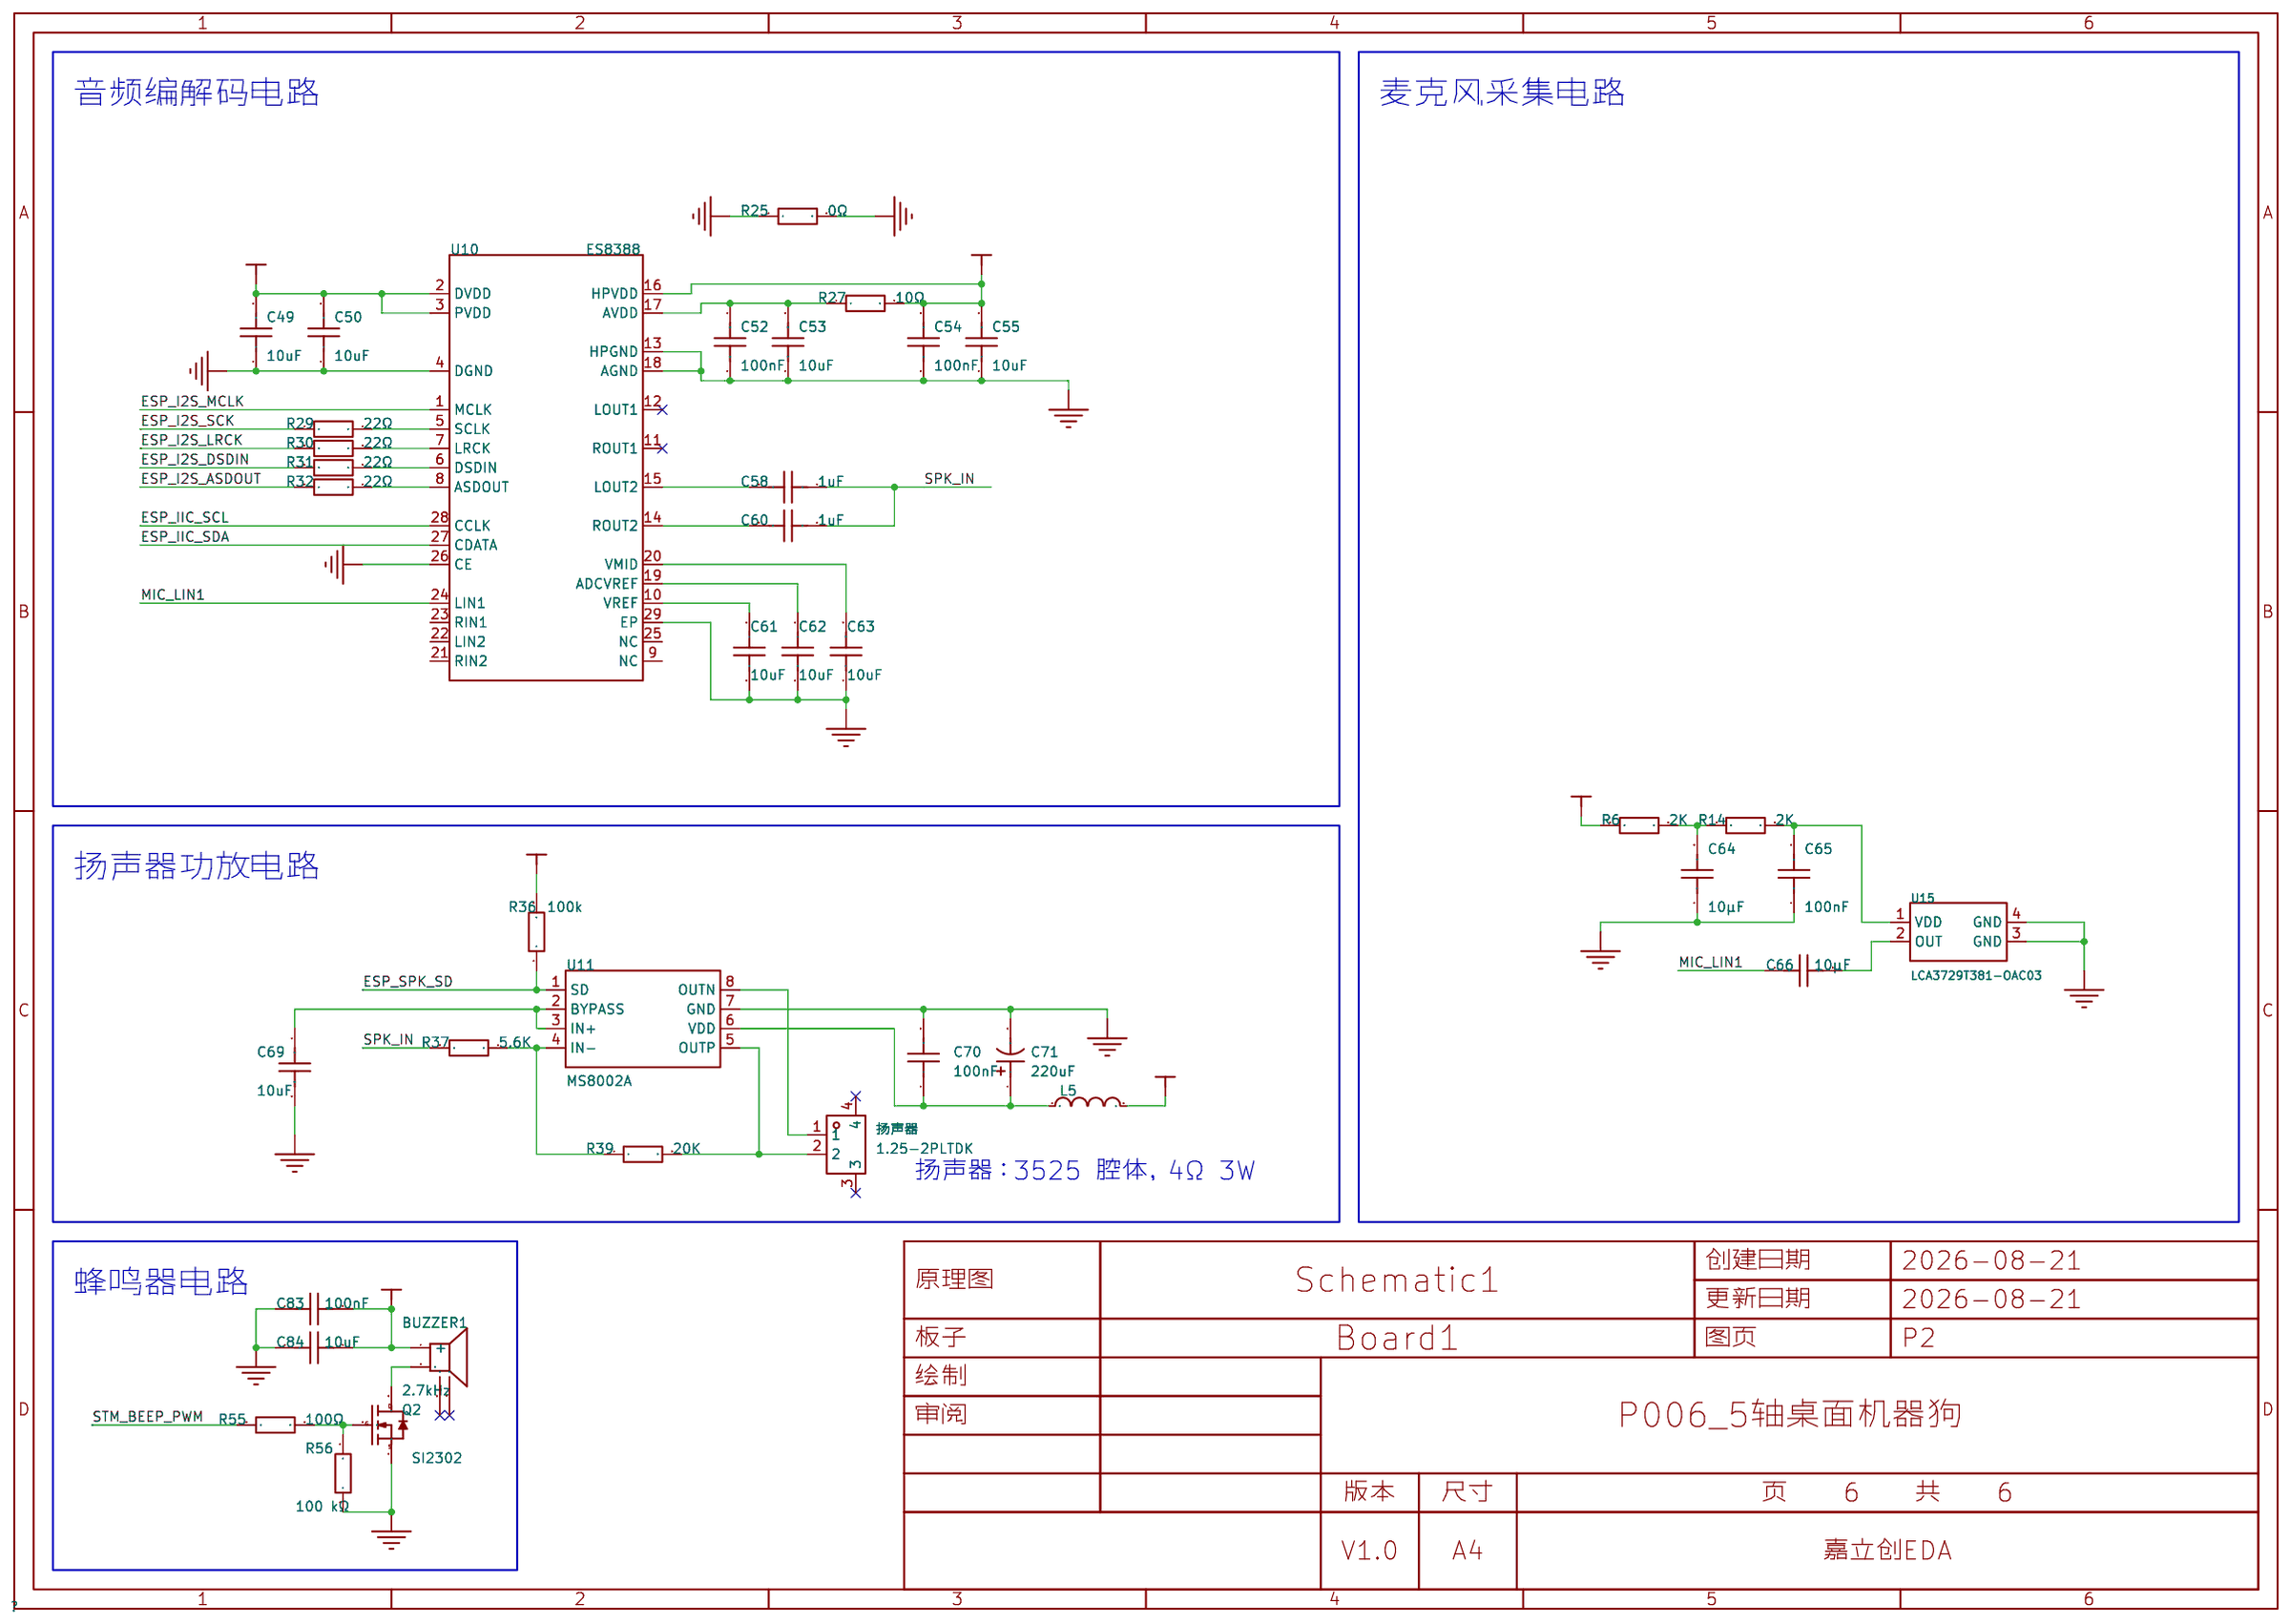
[diagram p8: 音频电路]

## Parts
sheet ESP32主控电路
C1  22uF  [C0603]
C2  100nF  [C0603]
C3  1uF  [C0603]
C85  10uF  [C0603]
C86  100nF  [C0603]
C87  100nF  [C0603]
D1  USBLC6-2SC6  [SOT-23-6_L2.9-W1.6-P0.95-LS2.8-BL]
D3  B540C-13-F  [SMC_L7.1-W6.2-LS8.1-RD]
ESP_BOOT  TSA016A2518A  [KEY-SMD_4P-L4.2-W3.4-P2.15-LS4.5-TL]
ESP_RES  TSA016A2518A  [KEY-SMD_4P-L4.2-W3.4-P2.15-LS4.5-TL]
F1  BSMD0603-050-6V  [F0603]
Q1  S8050  [SOT-23-3_L2.9-W1.3-P1.90-LS2.3-BR]
Q3  S8050  [SOT-23-3_L2.9-W1.3-P1.90-LS2.3-BR]
R3  22Ω  [R0603]
R4  22Ω  [R0603]
R5  10K  [R0603]
R12  10K  [R0603]
R13  10K  [R0603]
U2  2.4GHz  [WIRELM-SMD_ESP32-S3-WROOM-1]
U8  CH340C  [SOP-16_L10.0-W3.9-P1.27-LS6.0-BL]
USB1  TYPE-C 16PIN 2MD(073)  [USB-C-SMD_TYPE-C-16PIN-2MD-073]
sheet STM32主控电路
C4  22pF  [C0603]
C5  100nF  [C0603]
C6  100nF  [C0603]
C7  100nF  [C0603]
C8  100nF  [C0603]
C9  100nF  [C0603]
C10  100nF  [C0603]
C11  4.7uF  [C0603]
C12  4.7uF  [C0603]
C13  10nF  [C0603]
C14  1uF  [C0603]
C15  100nF  [C0603]
C16  1uF  [C0603]
C17  100nF  [C0603]
C18  1uF  [C0603]
C19  2.2uF  [C0603]
C20  2.2uF  [C0603]
C21  100nF  [C0603]
C22  22pF  [C0603]
C23  22pF  [C0603]
C24  22pF  [C0603]
CN2  X1270WR-2x05B-9TV01  [CONN-TH_10P-P1.27_XKB_X1270WR-2X05B-6TV01]
R7  10K  [R0603]
R8  10K  [R0603]
R9  10Ω  [R0603]
R10  10K  [R0603]
STM_BOOT1  MSK12C02  [SW-TH_MSK12C02]
STM_RES1  TSA016A2518A  [KEY-SMD_4P-L4.2-W3.4-P2.15-LS4.5-TL]
U1  STM32F407VET6  [LQFP-100_L14.0-W14.0-P0.50-LS16.0-BL]  (sections 1,2)
X1  8MHz  [CRYSTAL-SMD_L5.0-W3.2]
X2  32.768kHz  [CRYSTAL-SMD_L3.2-W1.5-1]
sheet 传感器电路
C76  4.7nF  [C0603]
C77  4.7nF  [C0603]
C78  10uF  [C0603]
C79  5pF  [C0603]
C80  100nF  [C0603]
C81  5pF  [C0603]
C82  100nF  [C0603]
R50  10K  [R0603]
R51  10K  [R0603]
R52  2K  [R0603]
R53  2K  [R0603]
U12  AHT20  [SENSOR-SMD_L3.0-W3.0-P1.00-BR]
U13  AI01C  [SOT-23-6_L2.9-W1.6-P0.95-LS2.8-BL]
U14  AI01C  [SOT-23-6_L2.9-W1.6-P0.95-LS2.8-BL]
触摸_1  1.25-2PLTDK  [CONN-SMD_2P-P1.25_SHOUHAN_1.25-2PLTDK]
触摸_2  1.25-2PLTDK  [CONN-SMD_2P-P1.25_SHOUHAN_1.25-2PLTDK]
sheet 充电电路
C89  100nF  [C0603]
C90  100nF  [C0603]
C91  100nF  [C0603]
C92  100nF  [C0603]
C93  100nF  [C0603]
C94  100nF  [C0603]
C95  100nF  [C0603]
C96  100nF  [C0603]
C97  100nF  [C0603]
C98  100nF  [C0603]
C99  100nF  [C0603]
C100  100nF  [C0603]
C101  100nF  [C0603]
C103  220uF  [CAP-SMD_BD6.3-L6.6-W6.6-LS7.4-FD]
C104  10uF  [C0603]
L8  1uH  [IND-SMD_L4.4-W4.2]
Q7  AO3401  [SOT-23-3_L2.9-W1.4-P1.90-LS2.6-BR]
Q8  AO3401  [SOT-23-3_L2.9-W1.4-P1.90-LS2.6-BR]
Q9  AO3401  [SOT-23-3_L2.9-W1.4-P1.90-LS2.6-BR]
Q10  AO3401  [SOT-23-3_L2.9-W1.4-P1.90-LS2.6-BR]
R1  10K  [R0603]
R2  10K  [R0603]
R46  10K  [R0603]
R47  10K  [R0603]
R48  10K  [R0603]
R49  10K  [R0603]
R54  10K  [R0603]
SW2  TS24CA  [SW-SMD_2P-TS24CA]
U6  IP5310_I2C  [QFN-32_L5.0-W5.0-P0.50-BL-EP3.4]
sheet 引脚分配
U9  XL9555  [TSSOP-24_L7.8-W4.4-P0.65-LS6.4-BL]
sheet 执行器电路
R57  1K  [R0603]
R58  1K  [R0603]
STM_LED_1  -  [LED_0603]
STM_LED_2  -  [LED_0603]
右前腿  2.0-3PWTDK  [CONN-SMD_3P-P2.00_SHOU_2.0-3PWTDK]
右后腿  2.0-3PWTDK  [CONN-SMD_3P-P2.00_SHOU_2.0-3PWTDK]
左前腿  2.0-3PWTDK  [CONN-SMD_3P-P2.00_SHOU_2.0-3PWTDK]
左后腿  2.0-3PWTDK  [CONN-SMD_3P-P2.00_SHOU_2.0-3PWTDK]
sheet 电源电路
+3.3v  -  [LED_0603]
+5v  -  [LED_0603]
C25  100nF  [C0603]
C26  10uF  [C0603]
C27  100nF  [C0603]
C28  10uF  [C0603]
C29  10uF  [C0603]
C30  100nF  [C0603]
C31  10uF  [C0603]
C32  1000pF  [C0603]
C33  47µF  [C1206]
C34  47pF  [C0603]
C35  10uF  [C0603]
C36  100nF  [C0603]
C37  10uF  [C0603]
C47  47µF  [C1206]
C72  4.7µF  [C1206]
C73  4.7µF  [C1206]
C74  10 nF  [C1206]
C75  10 nF  [C1206]
D6  B340A-E3/61T  [SMA_L4.3-W2.6-LS5.2-RD]
L7  6.8uH  [IND-SMD_L7.0-W6.6]
R11  1K  [R0603]
R40  1K  [R0603]
R41  10.2K  [R0603]
R42  133kΩ  [R0603]
R43  3.24K  [R0603]
R44  32.8kΩ  [R0603]
R45  29.4K  [R0603]
U3  TPS54331DDAR  [SOIC-8_L4.9-W3.9-P1.27-LS6.0-BL-EP]
U4  RT9013-28GB  [SOT-23-5_L2.9-W1.6-P0.95-LS2.8-BR]
U5  RT9013-15GB  [SOT-23-5_L2.9-W1.6-P0.95-LS2.8-BR]
U7  RT9013-33GB-MS  [SOT-23-5_L2.9-W1.6-P0.95-LS2.8-BR]
sheet 视频电路
C38  100nF  [C0603]
C39  10uF  [C0603]
C40  100nF  [C0603]
C41  10uF  [C0603]
C42  100nF  [C0603]
C43  10uF  [C0603]
C44  100nF  [C0603]
C45  10uF  [C0603]
C46  100nF  [C0603]
L1  BLM18PG121SN1D  [L0603]
L2  BLM18PG121SN1D  [L0603]
L3  BLM18PG121SN1D  [L0603]
L4  BLM18PG121SN1D  [L0603]
L6  BLM18PG121SN1D  [L0603]
X3  24MHz  [OSC-SMD_4P-L3.2-W2.5-BL]
摄像头  AFC07-S24ECC-00  [FPC-SMD_24P-L17.5-W5.4-P0.50]
显示屏  AFC01-S16FCA-00  [FPC-SMD_P0.50-16P_FGS-XJ-H2.0]
sheet 音频电路
BUZZER1  2.7kHz  [BUZ-SMD_4P-L8.5-W8.5-P8.50-BR]
C49  10uF  [C0603]
C50  10uF  [C0603]
C52  100nF  [C0603]
C53  10uF  [C0603]
C54  100nF  [C0603]
C55  10uF  [C0603]
C58  1uF  [C0603]
C60  1uF  [C0603]
C61  10uF  [C0603]
C62  10uF  [C0603]
C63  10uF  [C0603]
C64  10µF  [C0603]
C65  100nF  [C0603]
C66  10µF  [C0603]
C69  10uF  [C0603]
C70  100nF  [C0603]
C71  220uF  [CAP-SMD_BD6.3-L6.6-W6.6-LS7.4-FD]
C83  100nF  [C0603]
C84  10uF  [C0603]
L5  BLM18PG121SN1D  [L0603]
Q2  SI2302  [SOT-23-3_L2.9-W1.3-P1.90-LS2.4-BR]
R6  2K  [R0603]
R14  2K  [R0603]
R25  0Ω  [R0603]
R27  10Ω  [R0603]
R29  22Ω  [R0603]
R30  22Ω  [R0603]
R31  22Ω  [R0603]
R32  22Ω  [R0603]
R36  100k  [R0603]
R37  5.6K  [R0603]
R39  20K  [R0603]
R55  100Ω  [R0603]
R56  100 kΩ  [R0603]
U10  ES8388  [QFN-28_L4.0-W4.0-P0.45-BL-EP]
U11  MS8002A  [SOIC-8_L5.0-W4.0-P1.27-LS6.0-BL]
U15  LCA3729T381-OAC03  [MIC-SMD_4P-L3.8-W3.0_LMA3729T421-OA1]
扬声器  1.25-2PLTDK  [CONN-SMD_2P-P1.25_SHOUHAN_1.25-2PLTDK]

## Library data of the parts
C1-C32 C34-C46 C49 C50 C52-C55 C58 C60-C66 C69 C70 C76-C87 C89-C101 = CAP_0603: Supplier Footprint: 0603
D1 = USBLC6-2SC6_C7519: 极性:单向;反向截止电压(Vrwm):5.25V;钳位电压:17V;峰值脉冲电流(Ipp):5A;击穿电压:6V;; LCSC Part Name: 单向ESD; Supplier Part: C7519; Manufacturer: ST(意法半导体); Supplier Footprint: SOT-23-6L; JLCPCB Part Class: Extended Part; Datasheet: https://item.szlcsc.com/datasheet/USBLC6-2SC6/7996.html; Supplier: LCSC; Polarity: 单向; Reverse Stand-Off Voltage (Vrwm): 5.25V; Clamping Voltage: 17V; Peak Pulse Current (Ipp): 5A; Voltage - Breakdown: 6V; Reverse Leakage Current (Ir): 150nA; Number of Channels: 双路; Operating Temperature: -40℃~+125℃; level of protection: IEC 61000-4-2; Type: ESD; Junction Capacitance: 3.5pF
D3 = B540C-13-F: 二极管配置:1个独立式;正向压降(Vf):550mV@5A;直流反向耐压(Vr):40V;整流电流:5A;; LCSC Part Name: 电压:40V 电流:5A; Supplier Part: C72264; Manufacturer: DIODES(美台); Supplier Footprint: SMC(DO-214AB); JLCPCB Part Class: Extended Part; Datasheet: https://item.szlcsc.com/datasheet/B540C-13-F/73373.html; Supplier: LCSC; Diode Configuration: 1个独立式; Voltage - Forward(Vf@If): 550mV@5A; Voltage - DC Reverse(Vr): 40V; Current - Rectified: 5A; Reverse Leakage Current (Ir): 500uA@40V; Operating Junction Temperature Range: -55℃~+150℃; Non-Repetitive Peak Forward Surge Current: 100A
ESP_BOOT ESP_RES STM_RES1 = TSA016A2518A: 按钮形状:椭圆形按钮;作用力:1.8N;安装方式:立贴;开关长度:4.2mm;开关宽度:3.35mm;开关高度:2.5mm;触点电流:50mA;额定电压:12V;工作寿命:-;; LCSC Part Name: 3.2*4.2*2.5H-J 180gf 白钮翘脚; Supplier Part: C2888427; Manufacturer: BZCN(博众电气); Supplier Footprint: SMD,4.2x3.4mm; JLCPCB Part Class: Extended Part; Datasheet: https://item.szlcsc.com/datasheet/TSA016A2518A/3108830.html; Supplier: LCSC; Actuator Style: 椭圆形按钮; Operating Force: 1.8N; Mounting Type: 立贴; Length: 4.2mm; Width: 3.35mm; Switch Height: 2.5mm; Contact Current: 50mA; Voltage Rating: 12V; Actuator/Cap Color: 白色
F1 = BSMD0603-050-6V: 耐压(Vmax):6V;最大电流(Imax):40A;保持电流(Ihold):500mA;跳闸电流(Itrip):1A;; LCSC Part Name: 6V 500mA 0603自恢复; Supplier Part: C883095; Manufacturer: BHFUSE(佰宏); Supplier Footprint: 0603; JLCPCB Part Class: Extended Part; Datasheet: https://item.szlcsc.com/datasheet/BSMD0603-050-6V/947770.html; Supplier: LCSC; Voltage - Max: 6V; Current - Max: 40A; Hold Current: 500mA; Trip Current: 1A; Power Dissipation: 500mW; Resistance - Initial (Ri) (Min): 100mΩ; Resistance - Post Trip (R1) (Max): 800mΩ; Operating Temperature: -40℃~+85℃; Length: 1.85mm; Width: 1.05mm; Height: 1.15mm
Q1 Q3 = S8050_C20069125: 晶体管类型:NPN;集电极电流(Ic):500mA;集射极击穿电压(Vceo):25V;耗散功率(Pd):300mW;直流电流增益(hFE):120;; LCSC Part Name: hFE:200-350，丝印:J3Y NPN 500mA 25V; Supplier Part: C20069125; Manufacturer: R+O(宏嘉诚); Supplier Footprint: SOT-23; JLCPCB Part Class: Extended Part; Datasheet: https://item.szlcsc.com/datasheet/S8050/21397163.html; Supplier: LCSC; type: NPN; Current - Collector(Ic): 500mA; Collector - Emitter Voltage VCEO: 25V; Pd - Power Dissipation: 300mW; DC Current Gain: 120; Transition frequency(fT): 100MHz; Current - Collector Cutoff: 100nA; Vce Saturation(VCE(sat)): 600mV; Operating Temperature: -55℃~+150℃; Emitter-Base Voltage(Vebo): 5V; Number: 1个NPN; Configuration: 独立式
R1-R14 R25 R27 R29-R32 R36 R37 R39-R58 = Res_0603: Supplier Footprint: 0603
U2 = ESP32-S3-WROOM-1-N16R8: 核心芯片:ESP32-S3R8;频率:2.4GHz;天线形式:板载PCB天线;发射功率:20.5dBm;接收灵敏度:-103.5dBm;; LCSC Part Name: 不带固件 通用型Wi-Fi+低功耗蓝牙MCU模组; Supplier Part: C2913202; Manufacturer: ESPRESSIF(乐鑫); Supplier Footprint: SMD,25.5x18mm; JLCPCB Part Class: Extended Part; Datasheet: https://item.szlcsc.com/datasheet/ESP32-S3-WROOM-1-N16R8/3198300.html; Supplier: LCSC; Utilized IC / Part: ESP32-S3R8; Interface Type: I2C；GPIO；UART；SPI；USB；I2S; Antenna Type: 板载PCB天线; Output Power: 20.5dBm; Voltage - Supply: 3V~3.6V; Receive  Current: 95mA; Send  Current: 355mA; Sensitivity: -103.5dBm; Operating Temperature: -40℃~+65℃
U8 = CH340C: 应用功能:收发器;USB协议版本:USB 2.0;通道数:-;数据速率:2Mbps;; LCSC Part Name: USB转串口芯片; Supplier Part: C84681; Manufacturer: WCH(南京沁恒); Supplier Footprint: SOP-16; JLCPCB Part Class: Extended Part; Datasheet: https://item.szlcsc.com/datasheet/CH340C/85852.html; Supplier: LCSC; Applications Function: 收发器; USB Protocol: USB 2.0; Voltage - Supply: 3.3V；5V; Data Rate: 2Mbps; Operating Temperature: -20℃~+70℃; Current - Supply: 7mA; Quiescent Supply Current: 50uA; Features: 可编程波特率；内置时钟发生器；上电复位
USB1 = TYPE-C 16PIN 2MD(073): 连接器类型:Type-C;协议标准:-;公母:母;安装方式:卧贴;触点数量:16P;端口数量:1;额定电流 - 电源:3A;工作温度:-25℃~+85℃;; LCSC Part Name: Type-C 母 卧贴; Supplier Part: C2765186; Manufacturer: SHOU HAN(首韩); Supplier Footprint: SMD; JLCPCB Part Class: Extended Part; Datasheet: https://item.szlcsc.com/datasheet/TYPE-C%252016PIN%25202MD(073)/2901843.html; Supplier: LCSC; Connector Type: Type-C; Gender: 母; Mounting Type: 卧贴; Number of Contacts: 16P; Number of Ports: 1; Current Rating-Power: 3A; Voltage Rating: 5V; Connect-Disconnect Life: 1万次; Detection color: 黑色; Operating Temperature: -25℃~+85℃
CN2 = X1270WR-2x05B-9TV01: 连接器类型:简牛座;间距:1.27mm;结构:2x5P;额定电流:1A;额定电压:250V;安装方式:弯插;行距:1.27mm;排数:2;每排PIN数:5;触头材质:-;触头镀层:金;工作温度:-40℃~+125℃;; LCSC Part Name: 1.27mm 2x5P 排数:2 每排P数:5; Supplier Part: C2962231; Manufacturer: XKB Connection(中国星坤); Supplier Footprint: 弯插,P=1.27mm; JLCPCB Part Class: Extended Part; Datasheet: https://item.szlcsc.com/datasheet/X1270WR-2x05B-9TV01/3351707.html; Supplier: LCSC; Connector Type: 简牛座; Pitch: 1.27mm; Number of Positions or Pins: 2x5P; Current Rating: 1A; Voltage Rating (Max): 250V; Holder Type: 弯插; Row Spacing: 1.27mm; Number of Rows: 2; Number of PINs Per Row: 5; Contact Plating: 金; Operating Temperature: -40℃~+125℃; Color: 黑色
STM_BOOT1 = MSK12C02: 电路结构:单刀双掷;安装方式:卧贴;开关颜色:-;额定电流:50mA;额定电压:12V;工作寿命:1万次;; LCSC Part Name: MSK12C02 白柄1.5编带; Supplier Part: C431540; Manufacturer: SHOU HAN(首韩); Supplier Footprint: SMD,8x2.8mm; JLCPCB Part Class: Extended Part; Datasheet: https://item.szlcsc.com/datasheet/MSK12C02/427897.html; Supplier: LCSC; Circuit: 单刀双掷; Termination Style: SMD接片; Length: 8mm; Width: 2.8mm; Switch Height: 1.4mm; Mounting Type: 卧贴; Current Rating: 50mA; Voltage Rating: 12V; Life: 1万次; Operating Temperature: -20℃~+70℃
U1 = STM32F407VET6: CPU内核:ARM Cortex-M4;CPU最大主频:168MHz;CPU位数:32 Bit;; LCSC Part Name: 带DSP和FPU的高性能基础系列ARM Cortex-M4 MCU，具有512 KB Flash、168 MHz CPU、ART加速器、以太网和FSMC; Supplier Part: C28730; Manufacturer: ST(意法半导体); Supplier Footprint: LQFP-100(14x14); JLCPCB Part Class: Extended Part; Datasheet: https://item.szlcsc.com/datasheet/STM32F407VET6/29482.html; Supplier: LCSC; CPU Core: ARM Cortex-M4; CPU Maximum Speed: 168MHz; Core Size: 32 Bit; Program Storage Size: 512KB; Program Memory Type: FLASH; RAM Size: 192KB; Number of I/O: 82; ADC (Bit): 12bit; DAC (Bit): 12bit; Oscillator Type: 内置; Voltage - Supply: 1.8V~3.6V; Operating Temperature: -40℃~+85℃
X1 = X50328MSB2GI: 晶振类型:贴片晶振;频率:8MHz;常温频差:±10ppm;负载电容:20pF;频率稳定度:±20ppm;; LCSC Part Name: YSX530GA 8MHZ 2P 5032 20PF ±10PPM -40~85℃ (±20PPM); Supplier Part: C115962; Manufacturer: YXC(扬兴晶振); Supplier Footprint: SMD5032-2P; JLCPCB Part Class: Basic Part; Datasheet: https://item.szlcsc.com/datasheet/X50328MSB2GI/117214.html; Supplier: LCSC; Type: 贴片晶振; Normal temperature Frequency Tolerance: ±10ppm; Load Capacitance: 20pF; Frequency Stability: ±20ppm; Operating Temperature: -40℃~+85℃
X2 = XKXGI-SUA-32.768K: 晶振类型:贴片晶振;频率:32.768kHz;常温频差:±20ppm;负载电容:12.5pF;频率稳定度:±30ppm;; LCSC Part Name: YST310S 32.768KHZ 2P 3215 12.5PF ±20PPM -40~85℃; Supplier Part: C5213671; Manufacturer: YXC(扬兴晶振); Supplier Footprint: SMD3215-2P; JLCPCB Part Class: Extended Part; Datasheet: https://item.szlcsc.com/datasheet/XKXGI-SUA-32.768K/5908943.html; Supplier: LCSC; Type: 贴片晶振; Normal temperature Frequency Tolerance: ±20ppm; Load Capacitance: 12.5pF; Frequency Stability: ±30ppm; Operating Temperature: -40℃~+85℃
U12 = AHT20: 温度范围:-40℃~+120℃;湿度范围:0%RH~100%RH;接口类型:I2C;湿度精度:±2%RH;; LCSC Part Name: 温湿度传感器，完全标定，数字输出，IC接口; Supplier Part: C2757850; Manufacturer: 广州奥松; Supplier Footprint: SMD; JLCPCB Part Class: Extended Part; Datasheet: https://item.szlcsc.com/datasheet/AHT20/2874650.html; Supplier: LCSC; Temperature Range: -40℃~+120℃; Humidity: 0%RH~100%RH; Interface: I2C; Voltage - Supply: 2.2V~5.5V; Current - Supply: 570uA; Humidity Tolerance: ±2%RH; Temperature Tolerance: ±0.3℃; Resolution: 20bit
U13 U14 = AI01C: 通道数:1;; LCSC Part Name: 单通道触摸芯片; Supplier Part: C2943977; Manufacturer: Sam&wing(芯网); Supplier Footprint: SOT-23-6L; JLCPCB Part Class: 扩展库; Datasheet: https://atta.szlcsc.com/upload/public/pdf/source/20220822/7FBF328F0E1B91F043D74B98771C088B.pdf; Supplier: LCSC; The Channel Number: 1
扬声器 触摸_1 触摸_2 = 1.25-2PLTDK: 插针结构:1x2P;间距:1.25mm;安装方式:立贴;参考系列:GH;总PIN数:2P;排数:1;每排PIN数:2;行距:-;额定电流:1A;触头材质:磷青铜;触头镀层:锡;工作温度:-25℃~+85℃;; LCSC Part Name: 米色 1x2P 间距:1.25mm 立贴 系列:GH; Supplier Part: C3008547; Manufacturer: SHOU HAN(首韩); Supplier Footprint: SMD,P=1.25mm; JLCPCB Part Class: Extended Part; Datasheet: https://item.szlcsc.com/datasheet/1.25-2PLTDK/3501394.html; Supplier: LCSC; Pins Structure: 1x2P; Pitch: 1.25mm; Mounting Type: 立贴; Reference Series: GH; Number of Pins: 2P; Number of Rows: 1; Number of PINs Per Row: 2; Current Rating: 1A; Contact Material: 磷青铜; Contact Plating: 锡; Operating Temperature: -25℃~+85℃; Voltage Rating: 125V; Plastic Material: LCP; Flame Retardant Rating: UL94V-0; Color: 米色
C71 C103 = RVT1E221M0607: 容值:220uF;精度:±20%;额定电压:25V;纹波电流:150mA@120Hz;等效串联电阻(ESR):-;; LCSC Part Name: 220uF ±20% 25V; Supplier Part: C2918361; Manufacturer: ROQANG(容强); Supplier Footprint: SMD,D6.3xL7.7mm; JLCPCB Part Class: Extended Part; Datasheet: https://atta.szlcsc.com/upload/public/pdf/source/20241024/87413EF5140CF44BEEEC408A2EAB4036.pdf; Supplier: LCSC; Tolerance: ±20%; Voltage Rating: 25V; Ripple Current: 150mA@120Hz; Diameter: 6.3mm; Height - Seated (Max): 7.7mm; Lifetime: 2000hrs@105℃; Operating Temperature: -40℃~+105℃
C104 = HGC0603R5106M250NTHJ: 容值:10uF;精度:±20%;额定电压:25V;温度系数:X5R;; LCSC Part Name: 10uF ±20% 25V; Supplier Part: C7472961; Manufacturer: Chinocera(华瓷); Supplier Footprint: 0603; JLCPCB Part Class: Extended Part; Datasheet: https://item.szlcsc.com/datasheet/HGC0603R5106M250NTHJ/8532808.html; Supplier: LCSC; Tolerance: ±20%; Voltage Rating: 25V; Temperature Coefficient: X5R
L8 = FXL0420-1R0-M: 电感值:1uH;精度:±20%;额定电流:6A;饱和电流(Isat):7A;类型:一体成型电感;; LCSC Part Name: 1uH ±20% 7A; Supplier Part: C167203; Manufacturer: cjiang(长江微电); Supplier Footprint: SMD,4.4x4.2mm; JLCPCB Part Class: Extended Part; Datasheet: https://item.szlcsc.com/datasheet/FXL0420-1R0-M/178586.html; Supplier: LCSC; Tolerance: ±20%; Current Rating: 6A; Current - Saturation(Isat): 7A; DC Resistance(DCR): 27mΩ; Type: 一体成型电感
Q7-Q10 = AO3401_C727156: 数量:1个P沟道;漏源电压(Vdss):30V;连续漏极电流(Id):4.2A;导通电阻(RDS(on)):65mΩ@10V,4.2A;耗散功率(Pd):350mW;阈值电压(Vgs(th)):1.3V;; LCSC Part Name: 1个P沟道 耐压:30V 电流:4.2A; Supplier Part: C727156; Manufacturer: TWGMC(迪嘉); Supplier Footprint: SOT-23; JLCPCB Part Class: Extended Part; Datasheet: https://item.szlcsc.com/datasheet/AO3401/774261.html; Supplier: LCSC; Number: 1个P沟道; Drain to Source Voltage: 30V; Current - Continuous Drain(Id): 4.2A; RDS(on): 65mΩ@10V,4.2A; Pd - Power Dissipation: 350mW; Gate Threshold Voltage (Vgs(th)): 1.3V; Input Capacitance(Ciss): 954pF; Reverse Transfer Capacitance (Crss@Vds): 77pF; Operating Temperature: -55℃~+150℃; Type: P沟道; Output Capacitance(Coss): 115pF
SW2 = TS24CA: 电路结构:单刀单掷;按钮形状:矩形按钮;作用力:1.6N;安装方式:卧贴;开关长度:4.7mm;开关宽度:1.9mm;开关高度:3.5mm;带支架:不带支架;触点电流:50mA;额定电压:12V;带灯:无;工作寿命:2万次;; LCSC Part Name: 4.55*1.8*3.5mm 卧贴 轻触开关; Supplier Part: C393942; Manufacturer: SHOU HAN(首韩); Supplier Footprint: SMD,4.6x1.8mm; JLCPCB Part Class: Extended Part; Datasheet: https://item.szlcsc.com/datasheet/TS24CA/372554.html; Supplier: LCSC; Circuit: 单刀单掷; Actuator Style: 矩形按钮; Operating Force: 1.6N; Mounting Type: 卧贴; Length: 4.7mm; Width: 1.9mm; Switch Height: 3.5mm; with Bracket: 不带支架; Contact Current: 50mA; Voltage Rating: 12V; Actuator/Cap Color: 黑色; With Lamp: 无; Termination Style: SMD接片; Life: 2万次; Operating Temperature: -20℃~+70℃
U6 = IP5310: 工作电压:4.65V~5.5V;最大充电电流:3.2A;电池类型:锂电池;电池节数:1;; LCSC Part Name: 3A充电3.1A放电集成TYPEC协议移动电源SOC; Supplier Part: C191176; Manufacturer: INJOINIC(英集芯); Supplier Footprint: QFN-32-EP(5x5); JLCPCB Part Class: Extended Part; Datasheet: https://item.szlcsc.com/datasheet/IP5310/214272.html; Supplier: LCSC; The Chip Type: 充电芯片; Voltage - Supply: 4.65V~5.5V; Charge Current - Max: 3.2A; End-Off Voltage: 2.9V; Type of Battery: 锂电池; Number of Cells: 1; Battery Temperature Detection: 支持; 0V Battery Charge: 支持; Supply Current (Iq): 50uA
U9 = XL9555: 接口:I2C；SMBus;I/O数量:16;时钟频率:400kHz;; LCSC Part Name: 16位I²C总线和SMBus I/O端口扩展器，带中断输出和配置寄存器; Supplier Part: C609791; Manufacturer: XINLUDA(信路达); Supplier Footprint: TSSOP-24; JLCPCB Part Class: Extended Part; Datasheet: https://atta.szlcsc.com/upload/public/pdf/source/20240911/FFF826D97BDA33B4BE55BC4C2C305DC8.pdf; Supplier: LCSC; Interface: I2C；SMBus; Number of I/O: 16; Interrupt Output: 有中断输出; Supply Voltage: 2.3V~5.5V; Clock Frequency: 400kHz; Operating Temperature: -40℃~+85℃
+3.3v +5v STM_LED_1 STM_LED_2 = LED_0603-G: Supplier Footprint: 0603
右前腿 右后腿 左前腿 左后腿 = 2.0-3PWTDK: 插针结构:1x3P;间距:2mm;安装方式:卧贴;参考系列:HY;总PIN数:3P;排数:1;每排PIN数:3;行距:-;额定电流:2A;触头材质:铜合金;触头镀层:锡;工作温度:-25℃~+85℃;; LCSC Part Name: 2.0-3P卧贴带扣编带; Supplier Part: C3008563; Manufacturer: SHOU HAN(首韩); Supplier Footprint: SMD,P=2mm,卧贴; JLCPCB Part Class: Extended Part; Datasheet: https://item.szlcsc.com/datasheet/2.0-3PWTDK/3501410.html; Supplier: LCSC; Pins Structure: 1x3P; Pitch: 2mm; Mounting Type: 卧贴; Reference Series: HY; Number of Pins: 3P; Number of Rows: 1; Number of PINs Per Row: 3; Current Rating: 2A; Contact Material: 铜合金; Contact Plating: 锡; Operating Temperature: -25℃~+85℃; Voltage Rating: 250V; Plastic Material: LCP; Flame Retardant Rating: UL94V-0; Color: 米色
C33 C47 C72-C75 = CAP_1206: Supplier Footprint: 1206
D6 = B340A-E3/61T: 正向压降(Vf):550mV@3A;直流反向耐压(Vr):40V;整流电流:3A;; LCSC Part Name: 电压:40V 电流:3A; Supplier Part: C15570; Manufacturer: VISHAY(威世); Supplier Footprint: SMA(DO-214AC); JLCPCB Part Class: Extended Part; Datasheet: https://item.szlcsc.com/datasheet/B340A-E3%252F61T/16249.html; Supplier: LCSC; Voltage - Forward(Vf@If): 550mV@3A; Voltage - DC Reverse(Vr): 40V; Current - Rectified: 3A; Reverse Leakage Current (Ir): 500uA@40V; Operating Junction Temperature Range: -65℃~+150℃; Non-Repetitive Peak Forward Surge Current: 65A
L7 = FXL0630-6R8-M: 电感值:6.8uH;精度:±20%;额定电流:5A;饱和电流(Isat):6A;类型:一体成型电感;; LCSC Part Name: 6.8uH ±20% 6A; Supplier Part: C167221; Manufacturer: cjiang(长江微电); Supplier Footprint: SMD,7x6.6mm; JLCPCB Part Class: Extended Part; Datasheet: https://item.szlcsc.com/datasheet/FXL0630-6R8-M/178604.html; Supplier: LCSC; Tolerance: ±20%; Current Rating: 5A; Current - Saturation(Isat): 6A; DC Resistance(DCR): 48mΩ; Type: 一体成型电感
U3 = TPS54331DDAR: 功能类型:降压型;工作电压:3.5V~28V;输出电压:800mV~25V;输出电流:3A;输出类型:可调;; LCSC Part Name: 降压型 3A 3.5V~28V; Supplier Part: C90761; Manufacturer: TI(德州仪器); Supplier Footprint: SOIC-8-EP; JLCPCB Part Class: Extended Part; Datasheet: https://www.ti.com/cn/lit/gpn/tps54331; Supplier: LCSC; Function: 降压型; Voltage - Supply: 3.5V~28V; Output Voltage: 800mV~25V; Output Current: 3A; Frequency - Switching: 570kHz; Operating Temperature: -40℃~+150℃@(TJ); Synchronous Rectifier: 否; Number of Outputs: 1; Topology: 降压式; Quiescent Current: 110uA; Switch tube (built-in/external): 内置; Output Type: 可调; Features: 轻载高效模式；外部补偿；逐波限流；可调软启动；过流保护
U4 = RT9013-28GB: 输出极性:正极;工作电压:5.5V;输出电压:2.8V;输出电流:500mA;电源纹波抑制比(PSRR):50dB@(10kHz);输出类型:固定;; LCSC Part Name: 500mA 5.5V; Supplier Part: C2972227; Manufacturer: RICHTEK(立锜); Supplier Footprint: SOT-23-5; JLCPCB Part Class: Extended Part; Datasheet: https://item.szlcsc.com/datasheet/RT9013-28GB/3366520.html; Supplier: LCSC; Output Configuration: 正极; Voltage - Supply: 5.5V; Output Voltage: 2.8V; Output Current: 500mA; Power Supply Rejection Ratio (PSRR): 50dB@(10kHz); Voltage Dropout: 400mV@(500mA); standby current: 50uA; Noise: 30uVrms; Features: 使能控制；过流保护；短路保护；热关断; Operating Temperature: -40℃~+85℃@(Ta); Output Type: 固定; Number of Outputs: 1
U5 = RT9013-15GB: 输出极性:正极;工作电压:5.5V;输出电压:1.5V;输出电流:500mA;电源纹波抑制比(PSRR):50dB@(10kHz);输出类型:固定;; LCSC Part Name: 1.5V 500mA 5.5V; Supplier Part: C3031675; Manufacturer: RICHTEK(立锜); Supplier Footprint: SOT-23-5; JLCPCB Part Class: Extended Part; Datasheet: https://item.szlcsc.com/datasheet/RT9013-15GB/3569860.html; Supplier: LCSC; Output Configuration: 正极; Voltage - Supply: 5.5V; Output Voltage: 1.5V; Output Current: 500mA; Power Supply Rejection Ratio (PSRR): 50dB@(10kHz); Voltage Dropout: 400mV@(500mA); standby current: 50uA; Noise: 30uVrms; Features: 使能控制；过流保护；短路保护；热关断; Operating Temperature: -40℃~+125℃@(Tj); Output Type: 固定; Number of Outputs: 1
U7 = RT9013-33GB-MS: 输出极性:正极;工作电压:5.5V;输出电压:3.3V;输出电流:500mA;电源纹波抑制比(PSRR):75dB@(1kHz);输出类型:固定;; LCSC Part Name: 3.3V 500mA 5.5V; Supplier Part: C7434207; Manufacturer: MSKSEMI(美森科); Supplier Footprint: SOT-23-5; JLCPCB Part Class: Extended Part; Datasheet: https://item.szlcsc.com/datasheet/RT9013-33GB-MS/8445383.html; Supplier: LCSC; Output Configuration: 正极; Voltage - Supply: 5.5V; Output Voltage: 3.3V; Output Current: 500mA; Power Supply Rejection Ratio (PSRR): 75dB@(1kHz); Voltage Dropout: 100mV@(100mA)；300mV@(200mA); standby current: 60uA; Noise: 50uVrms; Features: 过流保护；使能控制；短路保护; Operating Temperature: -40℃~+85℃; Output Type: 固定; Number of Outputs: 1
L1-L6 = BLM18PG121SN1D: 阻抗@频率:120Ω@100MHz;误差:±25%;直流电阻(DCR):50mΩ;; LCSC Part Name: 单路 0603磁珠 阻抗120Ω@100MHz; Supplier Part: C14709; Manufacturer: muRata(村田); Supplier Footprint: 0603; JLCPCB Part Class: Basic Part; Datasheet: https://item.szlcsc.com/datasheet/BLM18PG121SN1D/15379.html; Supplier: LCSC; Impedance @ Frequency: 120Ω@100MHz; Tolerance: ±25%; DC Resistance(DCR): 50mΩ; Current Rating: 2A; Number of Circuits: 1; Operating Temperature: -55℃~+125℃
X3 = OT2EL4C4JI-111OLP-24M: 频率:24MHz;常温频差:±10ppm;输出模式:CMOS;工作电压:1.8V~3.3V;频率稳定度:±20ppm;; LCSC Part Name: YSO110TR 24MHZ 1.8V-3.3V ±10PPM -40~85℃ (±20PPM) CMOS; Supplier Part: C5203548; Manufacturer: YXC(扬兴晶振); Supplier Footprint: SMD3225-4P; JLCPCB Part Class: Extended Part; Datasheet: https://item.szlcsc.com/datasheet/OT2EL4C4JI-111OLP-24M/5892910.html; Supplier: LCSC; Normal temperature Frequency Tolerance: ±10ppm; Output Type: CMOS; Voltage - Supply: 1.8V~3.3V; Frequency Stability: ±20ppm; Operating Temperature: -40℃~+85℃
摄像头 = AFC07-S24ECC-00: 锁定特性:抽屉式;触点类型:上接;触点数量:24P;间距:0.5mm;安装方式:卧贴;工作温度:-25℃~+85℃;; LCSC Part Name: 抽屉式 上接 P数:24P 间距:0.5mm; Supplier Part: C11092; Manufacturer: JS(钜硕电子); Supplier Footprint: SMD,P=0.5mm,卧贴; JLCPCB Part Class: Extended Part; Datasheet: https://item.szlcsc.com/datasheet/AFC07-S24ECC-00/11639.html; Supplier: LCSC; Locking Feature: 抽屉式; Contact Type: 上接; Number of Contacts: 24P; Pitch: 0.5mm; Mounting Type: 卧贴; FFC, FCB Thickness: 0.3mm; Height Above Board: 2mm; Contact Material: 磷青铜; Contact Plating: 锡; Operating Temperature: -25℃~+85℃; Rated Voltage (Max): 50V; Current Rating (Max): 400mA
显示屏 = AFC01-S16FCA-00: 锁定特性:翻盖式;触点类型:下接;触点数量:16P;间距:0.5mm;安装类型:卧贴;; LCSC Part Name: 间距:0.5mm P数:16P 翻盖式 下接; Supplier Part: C262665; Manufacturer: JS(钜硕电子); Supplier Footprint: SMD,P=0.5mm,卧贴; JLCPCB Part Class: Extended Part; Datasheet: https://atta.szlcsc.com/upload/public/pdf/source/20190816/C413942_2A72D1AC756EAE17EEDF756A339D4500.pdf; Supplier: LCSC; Locking Feature: 翻盖式; Contact Type: 下接; Number of Contacts: 16P; Pitch: 0.5mm; Mounting Type: 卧贴; FFC, FCB Thickness: 0.3mm; Height Above Board: 2mm
BUZZER1 = MLT-8530_C94599: 驱动方式:无源(外部驱动);构造类型:电磁式;额定电压:3.6V;频率:2.7kHz;声压(SPL):80dB;; LCSC Part Name: 无源(外部驱动) 电磁式 2.7kHz; Supplier Part: C94599; Manufacturer: 华能; Manufacturer Part: MLT-8530; Supplier Footprint: SMD,8.5x8.5mm; JLCPCB Part Class: Extended Part; Datasheet: https://item.szlcsc.com/datasheet/MLT-8530/95797.html; Supplier: LCSC; Driver Circuitry: 无源(外部驱动); Technology: 电磁式; Voltage Rating: 3.6V; Voltage - Supply: 2.5V~4.5V; Current Consumption: 95mA; Sound Pressure Level(SPL): 80dB; Length: 8.5mm; Width: 8.5mm; Height: 3.3mm; Operating Temperature: -20℃~+70℃; Mounting Type: 贴片
Q2 = SI2302_C181087: 数量:-;漏源电压(Vdss):20V;连续漏极电流(Id):3A;导通电阻(RDS(on)):110mΩ@2.5V,3.1A;耗散功率(Pd):400mW;阈值电压(Vgs(th)):1.2V@50uA;; LCSC Part Name: 耐压:20V 电流:3A; Supplier Part: C181087; Manufacturer: Hottech(合科泰); Supplier Footprint: SOT-23; JLCPCB Part Class: Extended Part; Datasheet: https://item.szlcsc.com/datasheet/SI2302/192484.html; Supplier: LCSC; Drain to Source Voltage: 20V; Current - Continuous Drain(Id): 3A; RDS(on): 110mΩ@2.5V,3.1A; Pd - Power Dissipation: 400mW; Gate Threshold Voltage (Vgs(th)): 1.2V@50uA; Gate Charge(Qg): 10nC@4.5V; Input Capacitance(Ciss): 237pF; Reverse Transfer Capacitance (Crss@Vds): 45pF; Operating Temperature: -55℃~+150℃; Output Capacitance(Coss): 120pF
U10 = ES8388: 分辨率:24;工作电压:1.7V~3.6V;接口类型:SPI；I2C;; LCSC Part Name: 音频解码芯片; Supplier Part: C365736; Manufacturer: Everest-semi(顺芯); Supplier Footprint: QFN-28-EP(4x4); JLCPCB Part Class: Extended Part; Datasheet: https://item.szlcsc.com/datasheet/ES8388/339918.html; Supplier: LCSC; Resolution: 24; Number of Channels: 2; Voltage - Supply: 1.7V~3.6V; Interface Type: SPI；I2C; Chip Type Parameters/Description: 音频ADC；音频解码器; Operating Temperature: -40℃~+85℃; Data rate: 10MHz; Sampling Rate: 96000Hz
U11 = MS8002A: 功放类型:AB类功放;扬声器通道数:单声道;输出功率:2.6Wx1@4Ω；2.8Wx1@3Ω；1.6Wx1@8Ω;静态电流(Iq):5mA;; LCSC Part Name: 单通道AB类差分输入音频功率放大器; Supplier Part: C49208384; Manufacturer: MSKSEMI(美森科); Supplier Footprint: SOP-8; JLCPCB Part Class: Extended Part; Datasheet: https://item.szlcsc.com/datasheet/MS8002A/51614561.html; Supplier: LCSC; Class: AB类功放; Speaker Channels: 单声道; Output Power: 2.6Wx1@4Ω；2.8Wx1@3Ω；1.6Wx1@8Ω; Voltage - Supply: 2.5V~5.5V; Total Harmonic Distortion + Noise (THD+N): 0.3%; Quiescent Current: 5mA; Signal-to-Noise Ratio: 89dB; Input Type: 差分; Power Supply Rejection Ratio (PSRR): 57dB; Number of Inputs: 1对差分输入
U15 = LCA3729T381-OAC03: 指向性:全指向型;信噪比:61dB;灵敏度:-38dB;阻抗:200Ω;; LCSC Part Name: MEMSmic硅麦3729 上进音 s-38db±1 snr61db 温度-40~100°; Supplier Part: C53446625; Manufacturer: LinkMems(聆麦声学); Supplier Footprint: SMD-4P,3.8x3mm; JLCPCB Part Class: Extended Part; Datasheet: https://item.szlcsc.com/datasheet/LCA3729T381-OAC03/56598450.html; Supplier: LCSC; Direction: 全指向型; Voltage - Supply: 2V; Current Consumption: 120uA; S/N Ratio: 61dB; Sensitivity: -38dB; Impedance: 200Ω; Length: 3.76mm; Width: 2.95mm; Height: 1.1mm; Operating Temperature: -40℃~+100℃; Features: 全向拾音

## Nets
+3.3V: BUZZER1.1(+) C1.2 C2.2 C5.2 C6.2 C7.2 C8.2 C9.2 C10.2 C11.2 C12.2 C15.2 C16.2 C17.2 C18.2 C33.2 C47.2 C49.2 C50.2 C78.2 C80.2 C82.2 C83.2 C84.2 CN2.7 L6.2 L7.2 R5.2 R9.1 R10.2 R36.2 R40.1 R41.2 R50.2 R51.2 R57.1 R58.1 STM_BOOT1.3 U1.11(VDD) U1.19(VDD) U1.21(VREF+) U1.22(VDDA) U1.28(VDD) U1.50(VDD) U1.75(VDD) U1.100(VDD) U2.2(3V3) U9.24(VDD) U10.2(DVDD) U10.3(PVDD) U12.2(VDD) U13.5(VDD) U14.5(VDD) 显示屏.2 显示屏.16
+3.3V_A: C36.2 C37.2 C54.2 C55.2 R6.1 R27.2 U7.5(VOUT) U10.16(HPVDD)
+5V: C26.2 C35.2 C72.2 C73.2 C74.2 C91.2 C92.2 C93.2 C94.2 C95.2 C103.1 C104.2 L5.2 Q7.2(S) Q8.2(S) Q9.2(S) Q10.2(S) R11.1 R42.2 R47.2 U3.2(VIN) U4.1(VIN) U4.3(EN) U6.19(VOUT) U6.20(VOUT) U6.21(VOUT) U6.22(VOUT) U7.1(VIN) U7.3(CE) 右前腿.2 右后腿.2 左前腿.2 左后腿.2
AGND: C52.1 C53.1 C54.1 C55.1 C61.1 C62.1 C63.1 C64.1 C65.1 R25.2 U10.13(HPGND) U10.18(AGND) U10.29(EP) U15.3(GND) U15.4(GND)
GND: +3.3v.1(C) +5v.1(C) C1.1 C2.1 C3.2 C4.2 C5.1 C6.1 C7.1 C8.1 C9.1 C10.1 C11.1 C12.1 C13.1 C14.1 C15.1 C16.1 C17.1 C18.1 C19.1 C20.1 C21.2 C22.2 C23.2 C24.2 C26.1 C27.1 C28.1 C29.1 C30.1 C31.1 C33.1 C34.2 C35.1 C36.1 C37.1 C38.1 C39.1 C40.1 C41.1 C42.1 C43.1 C44.1 C45.1 C46.1 C47.1 C49.1 C50.1 C69.2 C70.2 C71.2 C72.1 C73.1 C74.1 C75.1 C76.2 C77.2 C78.1 C79.1 C80.1 C81.1 C82.1 C83.1 C84.1 C85.1 C86.1 C87.1 C89.1 C90.1 C91.1 C92.1 C93.1 C94.1 C96.2 C97.1 C98.1 C99.1 C100.1 C101.1 C103.2 C104.1 CN2.3 CN2.4 D1.2 D6.2(A) ESP_BOOT.1 ESP_BOOT.2 ESP_RES.3 ESP_RES.4 Q2.2(S) R8.2 R25.1 R43.1 R44.1 R45.1 R49.1 R54.1 R56.1 STM_BOOT1.1 STM_BOOT1.4 STM_RES1.3 STM_RES1.4 SW2.1 U1.10(VSS) U1.20(VSSA) U1.27(VSS) U1.74(VSS) U1.99(VSS) U2.1(GND) U2.40(GND) U2.41(GND) U3.7(GND) U3.9(EP) U4.2(GND) U5.2(GND) U6.7(AGND) U6.31(LIGHT) U6.33(EP) U7.2(GND) U8.1(GND) U9.2(A1) U9.3(A2) U9.21(A0) U10.4(DGND) U10.26(CE) U11.7(GND) U12.5(GND) U13.2(GND) U14.2(GND) USB1.A1B12(GND) USB1.B1A12(GND) X3.2(GND) 右前腿.3 右后腿.3 左前腿.3 左后腿.3 摄像头.2 摄像头.15 摄像头.23 显示屏.1 显示屏.15
VBAT: C100.2 R48.1 U6.9(BAT)
VBUSG: C95.1 Q7.1(G) Q8.1(G) Q9.1(G) Q10.1(G) R47.1 U6.11(VBUSG)
BAT: C97.2 C98.2 C99.2 L8.2 R1.2 R2.2 R48.2
CAM_1.5V: C30.2 C31.2 L3.1 U5.5(VOUT)
CAM_2.8V: C27.2 C28.2 C29.2 L1.1 L2.1 L4.1 U4.5(VOUT) U5.1(VIN) U5.3(EN)
CC1: U6.12(CC1) USB1.A5(CC1)
CC2: U6.13(CC2) USB1.B5(CC2)
CH340_D+: U8.5(D+) USB1.A6(Dp1) USB1.B6(Dp2)
CH340_D-: U8.6(D-) USB1.A7(Dn1) USB1.B7(Dn2)
ESP_BOOT: ESP_BOOT.3 ESP_BOOT.4 Q1.3(C) U2.27(IO0)
ESP_CAM_AFVDD: C38.2 C39.2 L1.2 摄像头.24
ESP_CAM_AVDD: C44.2 C45.2 L4.2 摄像头.4
ESP_CAM_D0: U2.22(IO14) 摄像头.19
ESP_CAM_D1: U2.24(IO47) 摄像头.21
ESP_CAM_D2: U2.25(IO48) 摄像头.22
ESP_CAM_D3: U2.23(IO21) 摄像头.20
ESP_CAM_D4: U2.21(IO13) 摄像头.18
ESP_CAM_D5: U2.19(IO11) 摄像头.16
ESP_CAM_D6: U2.18(IO10) 摄像头.14
ESP_CAM_D7: U2.17(IO9) 摄像头.12
ESP_CAM_DOVDD: C40.2 C41.2 L2.2 摄像头.11
ESP_CAM_DVDD: C42.2 C43.2 L3.2 摄像头.10
ESP_CAM_HREF: U2.16(IO46) 摄像头.9
ESP_CAM_PCLK: U2.20(IO12) 摄像头.17
ESP_CAM_PWDN: U9.5(IO0_1) 摄像头.8
ESP_CAM_RESET: U9.4(IO0_0) 摄像头.6
ESP_CAM_SCL: R3.2 U2.14(IO20) U2.32(IO39) U9.22(SCL) U10.28(CCLK) 摄像头.5 显示屏.7
ESP_CAM_SDA: R4.2 U2.13(IO19) U2.31(IO38) U9.23(SDA) U10.27(CDATA) 摄像头.3 显示屏.6
ESP_CAM_STROBE: 摄像头.1
ESP_CAM_VSYNC: U2.15(IO3) 摄像头.7
ESP_CAM_XCLK: X3.3(OUT) 摄像头.13
ESP_GPIO_1: U2.39(IO1) 显示屏.14
ESP_GPIO_2: U2.38(IO2) 显示屏.13
ESP_GPIO_4: U2.4(IO4)
ESP_GPIO_5: U2.5(IO5)
ESP_GPIO_6: U2.6(IO6) U10.1(MCLK)
ESP_GPIO_7: R29.1 U2.7(IO7)
ESP_GPIO_8: U2.12(IO8) U9.1(INT#)
ESP_GPIO_15: R30.1 U2.8(IO15)
ESP_GPIO_16: R31.1 U2.9(IO16)
ESP_GPIO_17: R32.1 U2.10(IO17)
ESP_GPIO_18: R36.1 U2.11(IO18) U11.1(SD)
ESP_GPIO_35: U2.28(IO35)
ESP_GPIO_36: U2.29(IO36)
ESP_GPIO_37: U2.30(IO37)
ESP_GPIO_40: U2.33(IO40) 显示屏.8
ESP_GPIO_41: U2.34(IO41) 显示屏.9
ESP_GPIO_42: U2.35(IO42) 显示屏.10
ESP_GPIO_43: U2.37(TXD0) U8.3(RXD) 显示屏.12
ESP_GPIO_44: U2.36(RXD0) U8.2(TXD) 显示屏.11
ESP_GPIO_45: U2.26(IO45) 显示屏.5
ESP_QSPI_RES: U9.6(IO0_2) 显示屏.4
ESP_RESET: C3.1 ESP_RES.1 ESP_RES.2 Q3.3(C) R5.1 U2.3(EN)
ESP_TP_RES: U9.7(IO0_3) 显示屏.3
ESP_USB_D+: D1.1
ESP_USB_D-: D1.3
ESP_USB_VBUS: C85.2 C87.2 C90.2 F1.2 Q7.3(D) Q8.3(D) Q9.3(D) Q10.3(D) R46.2 U6.10(VBUS) U8.16(VCC) USB1.A4B9(VBUS) USB1.B4A9(VBUS)
KEY: C101.2 SW2.2 U6.8(KEY)
MIC_LIN1: C66.1 U10.24(LIN1)
SPK_IN: C58.1 C60.1 R37.1
STM_BEEP_PWM: R55.1
STM_BOOT0: R7.1 U1.94(BOOT0)
STM_BOOT1: R8.1 U1.37(PB2-BOOT1(PB2))
STM_IIC_CD_INT: U6.2(L3)
STM_IIC_SCL: R1.1 U6.32(L1) U12.3(SCL)
STM_IIC_SDA: R2.1 U6.1(L2) U12.4(SDA)
STM_LED_1: STM_LED_1.1(C)
STM_LED_2: STM_LED_2.1(C)
STM_OSC32_IN: C4.1 U1.8(PC14-OSC32_IN(PC14)) X2.1(OSC1)
STM_OSC32_OUT: C23.1 U1.9(PC15-OSC32_OUT(PC15)) X2.2(OSC2)
STM_OSC_IN: C24.1 U1.12(PH0-OSC_IN(PH0)) X1.1(OSC1)
STM_OSC_OUT: C22.1 U1.13(PH1-OSC_OUT(PH1)) X1.2(OSC2)
STM_PA0: U1.23(PA0-WKUP(PA0))
STM_PA1: U1.24(PA1)
STM_PA2: U1.25(PA2)
STM_PA3: U1.26(PA3)
STM_PA4: U1.29(PA4)
STM_PA5: U1.30(PA5)
STM_PA6: U1.31(PA6)
STM_PA7: U1.32(PA7)
STM_PA8: U1.67(PA8)
STM_PA9: U1.68(PA9)
STM_PA10: U1.69(PA10)
STM_PA11: U1.70(PA11)
STM_PA12: U1.71(PA12)
STM_PA15: U1.77(PA15(JTDI))
STM_PB0: U1.35(PB0)
STM_PB1: U1.36(PB1)
STM_PB3: U1.89(PB3(JTDOTRACESWO))
STM_PB4: U1.90(PB4(NJTRST))
STM_PB5: U1.91(PB5)
STM_PB6: U1.92(PB6)
STM_PB7: U1.93(PB7)
STM_PB8: U1.95(PB8)
STM_PB9: U1.96(PB9)
STM_PB10: U1.47(PB10)
STM_PB11: U1.48(PB11)
STM_PB12: U1.51(PB12)
STM_PB13: U1.52(PB13)
STM_PB14: U1.53(PB14)
STM_PB15: U1.54(PB15)
STM_PC0: U1.15(PC0)
STM_PC1: U1.16(PC1)
STM_PC2: U1.17(PC2)
STM_PC3: U1.18(PC3)
STM_PC4: U1.33(PC4)
STM_PC5: U1.34(PC5)
STM_PC6: U1.63(PC6)
STM_PC7: U1.64(PC7)
STM_PC8: U1.65(PC8)
STM_PC9: U1.66(PC9)
STM_PC10: U1.78(PC10)
STM_PC11: U1.79(PC11)
STM_PC12: U1.80(PC12)
STM_PC13: U1.7(PC13)
STM_PD0: U1.81(PD0)
STM_PD1: U1.82(PD1)
STM_PD2: U1.83(PD2)
STM_PD3: U1.84(PD3)
STM_PD4: U1.85(PD4)
STM_PD5: U1.86(PD5)
STM_PD6: U1.87(PD6)
STM_PD7: U1.88(PD7)
STM_PD8: U1.55(PD8)
STM_PD9: U1.56(PD9)
STM_PD10: U1.57(PD10)
STM_PD11: U1.58(PD11)
STM_PD12: U1.59(PD12)
STM_PD13: U1.60(PD13)
STM_PD14: U1.61(PD14)
STM_PD15: U1.62(PD15)
STM_PE0: U1.97(PE0)
STM_PE1: U1.98(PE1)
STM_PE2: U1.1(PE2)
STM_PE3: U1.2(PE3)
STM_PE4: U1.3(PE4)
STM_PE5: U1.4(PE5)
STM_PE6: U1.5(PE6)
STM_PE7: U1.38(PE7)
STM_PE8: U1.39(PE8)
STM_PE9: U1.40(PE9)
STM_PE10: U1.41(PE10)
STM_PE11: U1.42(PE11)
STM_PE12: U1.43(PE12)
STM_PE13: U1.44(PE13)
STM_PE14: U1.45(PE14)
STM_PE15: U1.46(PE15)
STM_RESET: C21.1 R10.1 STM_RES1.1 STM_RES1.2 U1.14(NRST)
STM_SERVO_LF: 左前腿.1
STM_SERVO_LR: 左后腿.1
STM_SERVO_RF: 右前腿.1
STM_SERVO_RR: 右后腿.1
STM_SWCLK: CN2.6 U1.76(PA14(JTCK-SWCLK))
STM_SWDIO: CN2.2 U1.72(PA13(JTMS-SWDIO))
STM_TCH_OUT_1: R50.1 U13.1(OUT)
STM_TCH_OUT_2: R51.1 U14.1(OUT)
STM_VBAT: C13.2 C14.2 R9.2 U1.6(VBAT)
STM_VCAP_1: C19.2 U1.49(VCAP_1)
STM_VCAP_2: C20.2 U1.73(VCAP_2)
USB_5V: D3.1(K)
$1N58: D1.4 R4.1
$1N60: D1.6 R3.1
$1N74: Q1.1(B) R12.1
$1N75: Q3.1(B) R13.1
$1N76: Q3.2(E) R12.2 U8.14(RTS#)
$1N77: Q1.2(E) R13.2 U8.13(DTR#)
$1N87: C86.2 U8.4(V3)
$2N7: R7.2 STM_BOOT1.2
$3N41: C96.1 U6.23(VIN) U6.24(VIN)
$3N43: L8.1 U6.14(LX) U6.15(LX) U6.16(LX) U6.17(LX) U6.18(LX)
$3N51: R54.2 U6.6(NTC)
$3N52: R49.2 U6.5(RSET)
$3N59: C89.2 R46.1
$4N5: +5v.2(A) R11.2
$4N6: +3.3v.2(A) R40.2
$4N25: R41.1 R43.2 U3.5(VSENSE)
$4N27: C32.1 R45.2
$4N28: C32.2 C34.1 U3.6(COMP)
$4N31: C25.2 D6.1(K) L7.1 U3.8(PH)
$4N32: C25.1 U3.1(BOOT)
$4N34: C75.2 U3.4(SS)
$4N35: R42.1 R44.2 U3.3(EN)
$5N4: C46.2 L6.1 X3.4(VDD)
$6N15: C70.1 C71.1 L5.1 U11.6(VDD)
$6N17: U11.8(OUTN) 扬声器.1
$6N19: R37.2 R39.1 U11.4(IN-)
$6N20: R39.2 U11.5(OUTP) 扬声器.2
$6N21: C69.1 U11.2(BYPASS) U11.3(IN+)
$6N25: C61.2 U10.10(VREF)
$6N26: C62.2 U10.19(ADCVREF)
$6N27: C63.2 U10.20(VMID)
$6N29: C60.2 U10.14(ROUT2)
$6N30: C58.2 U10.15(LOUT2)
$6N34: C52.2 C53.2 R27.1 U10.17(AVDD)
$6N52: R32.2 U10.8(ASDOUT)
$6N53: R31.2 U10.6(DSDIN)
$6N54: R30.2 U10.7(LRCK)
$6N55: R29.2 U10.5(SCLK)
$6N60: Q2.1(G) R55.2 R56.2
$6N62: BUZZER1.2 Q2.3(D)
$6N67: C64.2 R6.2 R14.1
$6N74: C66.2 U15.2(OUT)
$6N77: C65.2 R14.2 U15.1(VDD)
$7N3: C77.1 U14.6(C1)
$7N4: C76.1 U13.6(C1)
$7N7: C79.2 R52.1 触摸_1.1 触摸_1.2
$7N8: C81.2 R53.1 触摸_2.1 触摸_2.2
$7N9: R53.2 U14.3(KEY)
$7N10: R52.2 U13.3(KEY)
$8N50: R58.2 STM_LED_2.2(A)
$8N52: R57.2 STM_LED_1.2(A)
Net-(D1-5): D1.5 D3.2(A) F1.1

Not connected (* = marked no-connect by the designer): BUZZER1 3* 4*; CN2 1 5 8 9 10; SW2 3* 4*; U4 4(NC)*; U5 4(NC); U6 3(VSET) 4(VTHS) 25(DMC) 26(DPC) 27(DMA) 28(DPA) 29(DMB) 30(DPB); U7 4(NC)*; U8 7(NC.)* 8(OUT#)* 9(CTS#) 10(DSR#) 11(RI#) 12(DCD#) 15(R232); U9 8(IO0_4) 9(IO0_5) 10(IO0_6) 11(IO0_7) 12(VSS) 13(IO1_0) 14(IO1_1) 15(IO1_2) 16(IO1_3) 17(IO1_4) 18(IO1_5) 19(IO1_6) 20(IO1_7); U10 9(NC) 11(ROUT1)* 12(LOUT1)* 21(RIN2) 22(LIN2) 23(RIN1) 25(NC); U12 1(NC)* 6(NC)*; U13 4(MD)*; U14 4(MD)*; USB1 13(EH)* 14(EH)* A8(SBU1) B8(SBU2); X3 1(Tri-state)*; 右前腿 4* 5*; 右后腿 4* 5*; 左前腿 4* 5*; 左后腿 4* 5*; 扬声器 3* 4*; 摄像头 25* 26*; 显示屏 17* 18*; 触摸_1 3* 4*; 触摸_2 3* 4*

## Notes on the sheets
sheet 1
- STM32 通讯
- 音频
- 屏幕
- 扩展IO
- IIC
- 摄像头
sheet 2
- 摄像头电源2.8V
- 摄像头电源1.5V
- 音频电源3.3V
- 电源指示灯
- 3.3V输出
sheet 3
- 注意IP5310选择I2C版本
- 在I2C模式下，
  IP5310关机时
  L3为低电平，
  IP5310开机时
  L3为高电平，
  可以用L3来作
  为MCU的唤醒
  控制。
- 电池内阻设定
- 10K
- 45
- 33K
- 67.5
- 68K
- 90
- 100K
- 30
- NC
- 22.5
sheet 4
- 触摸电路
- 温湿度电路
sheet 5
- 摄像头连接电路
- 显示屏连接电路
- 自动对焦电源 -> 2.8V
- ESP_CAM_AGND
- ESP_IIC_SDA
- 模拟电源 -> 2.8V
- ESP_IIC_SCL
- 数字内核电源 -> 1.5V
- 数字接口电源 -> 2.8V
- 数字接口电源 -> 2.8V
- ESP_CAM_DGND
- ESP_CAM_AF_GND
- 自动对焦电源 -> 2.8V
- 数字内核电源 -> 1.5V
- 模拟电源 -> 2.8V
- 信号映射
- 摄像头 IIC 信号映射
sheet 6
- 左前腿
- 左后腿
- LED电路
- 右前腿
- 右后腿
- 右前腿髋关节
- SERVO_LF_ABD     左前腿外展关节
  SERVO_LF_HIP     左前腿髋关节
  SERVO_LF_KNEE    左前腿膝关节
  SERVO_RF_ABD     右前腿外展关节
  SERVO_RF_HIP     右前腿髋关节
  SERVO_RF_KNEE    右前腿膝关节
  SERVO_LR_ABD     左后腿外展关节
  SERVO_LR_HIP     左后腿髋关节
  SERVO_LR_KNEE    左后腿膝关节
  SERVO_RR_ABD     右后腿外展关节
  SERVO_RR_HIP     右后腿髋关节
  SERVO_RR_KNEE    右后腿膝关节
sheet 7
- 主控电路
- USB电路
- 自动下载
- 防静电电路
- 靠近 ESP
- 内部 PSRAM 使用 不能作为其他功能
- 靠近 ESP
- 使能电路
- 启动电路
sheet 8
- 主控电路
- 晶振电路
- 启动电路
- BOOT1	BOOT0		启动模式					启动区域			说明
  0			0		Flash启动				用户Flash			正常运行用户程序（推荐）
  0			1		System Memory启动		系统存储器			串口ISP下载程序
- 电源电路
- 下载电路
- 复位电路
sheet 9
- 音频编解码电路
- 麦克风采集电路
- 扬声器功放电路
- 扬声器：3525 腔体，4Ω 3W
- 蜂鸣器电路
